# EAGLE schematic RU-PCBA-2X2-001-03 (EAGLE 9.7.0), part 2 of 5
## Sheet 4 of 17: Row 4
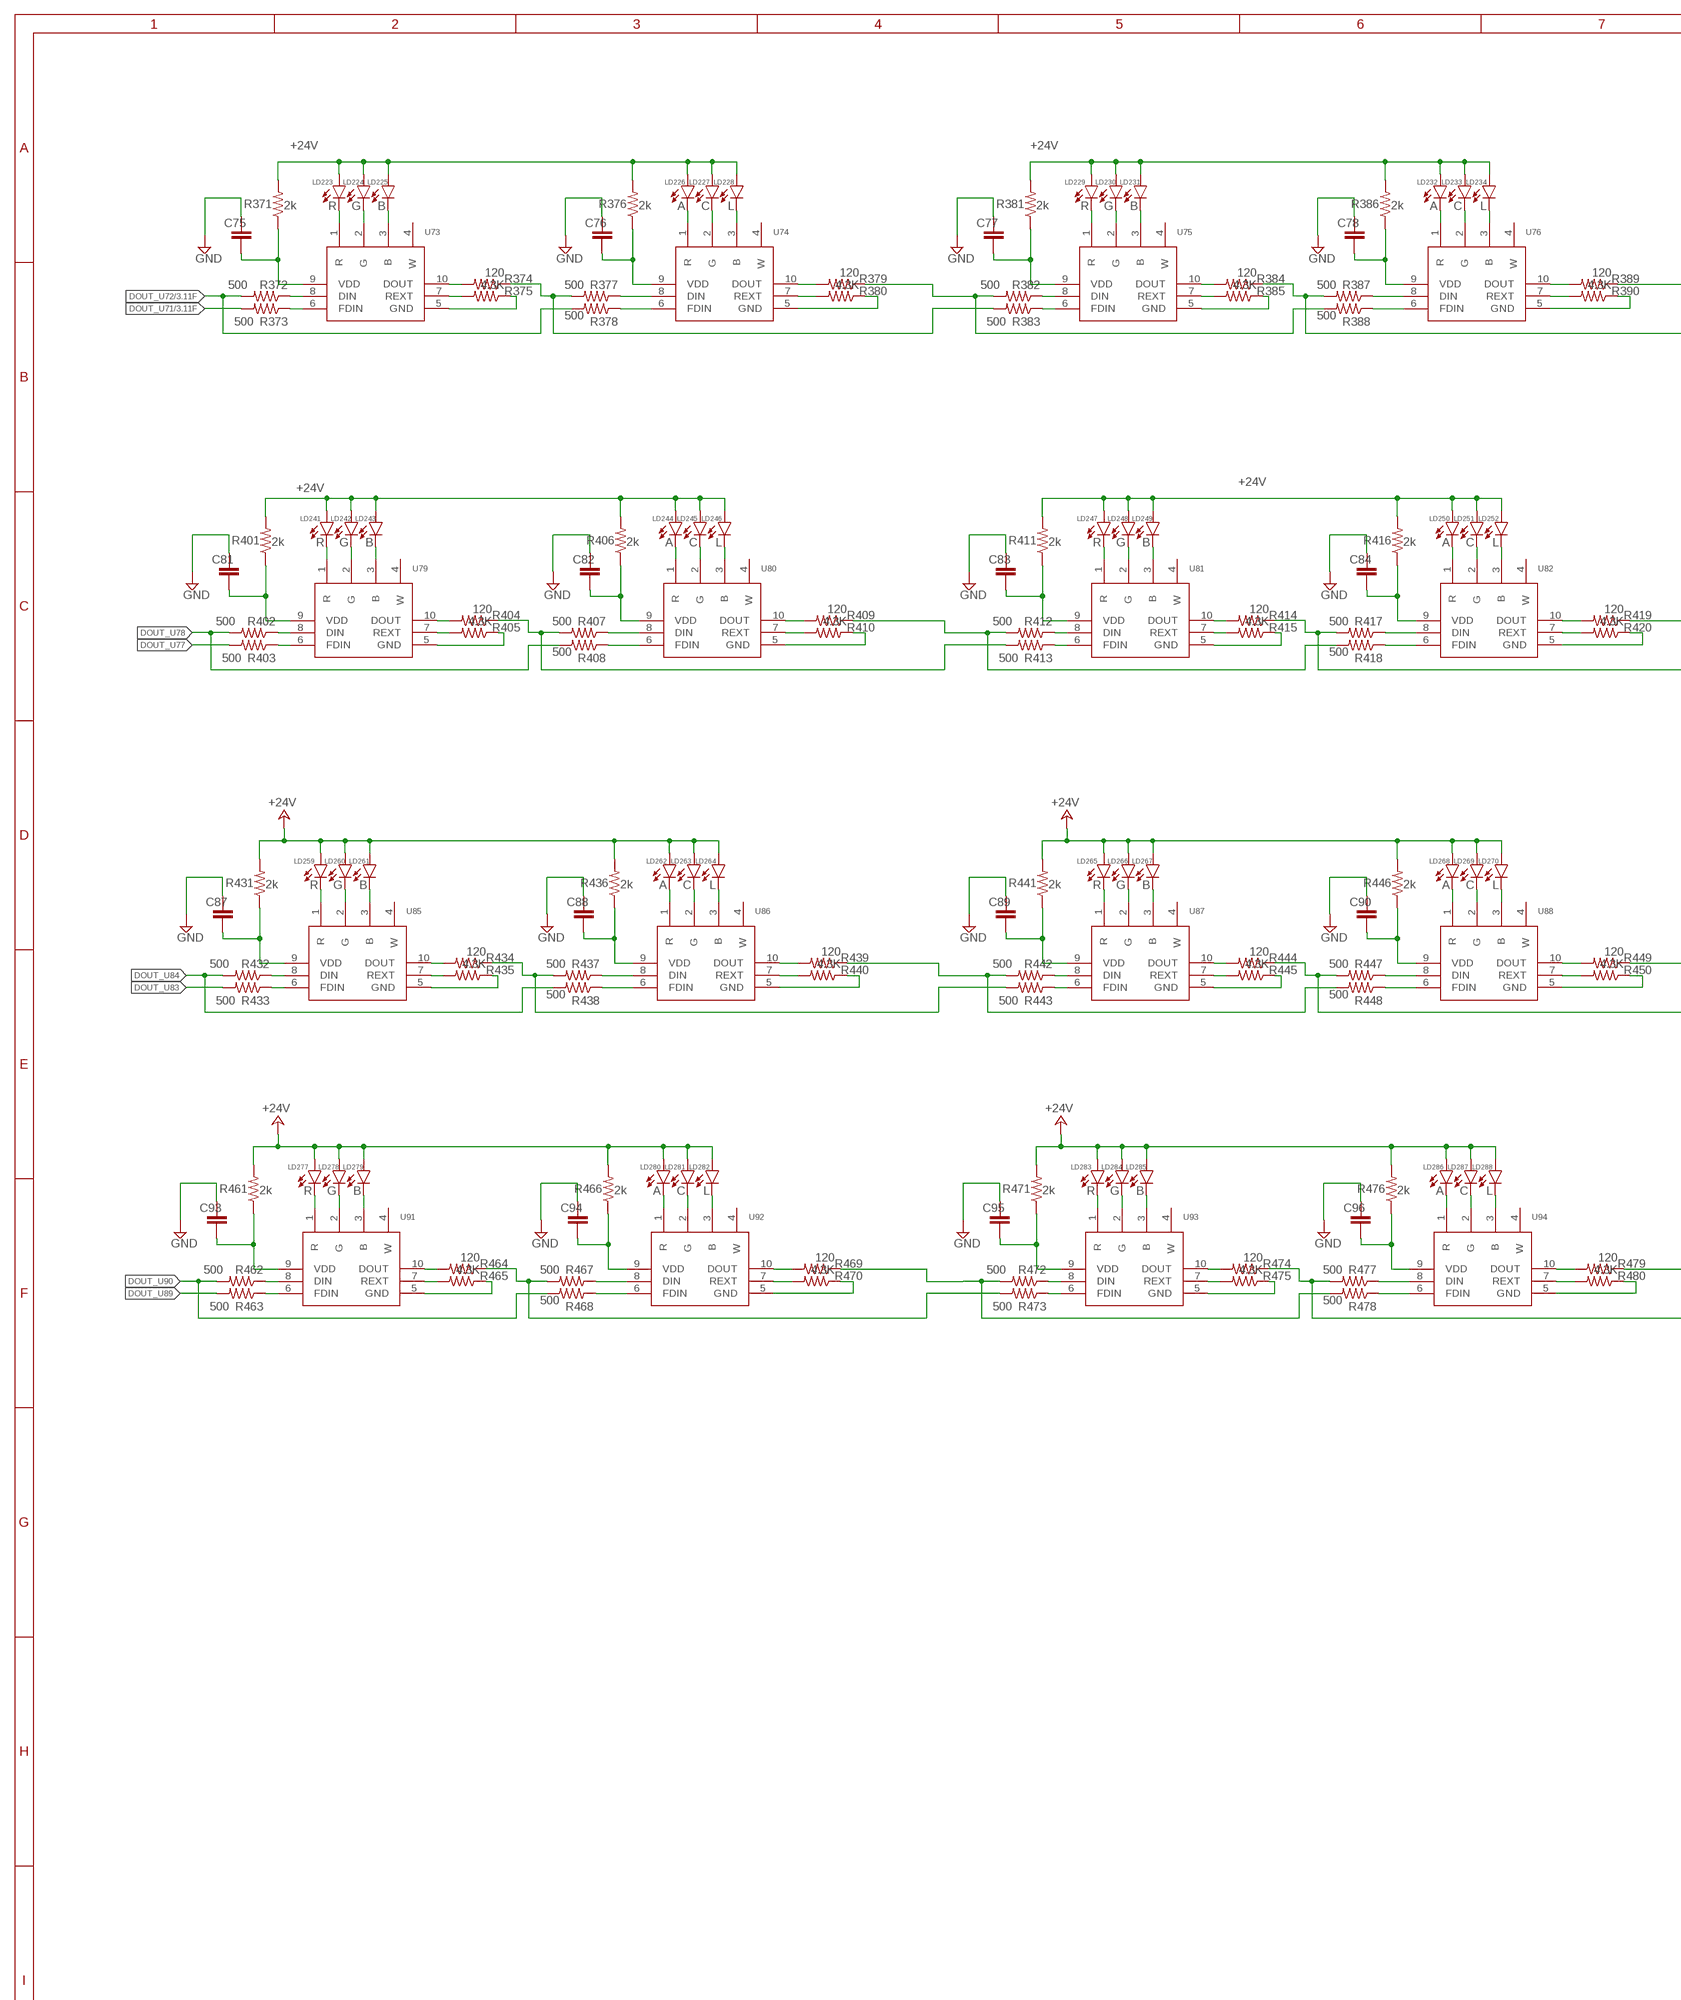
[diagram p6: schematic, sheet 4, part 1 of 2]
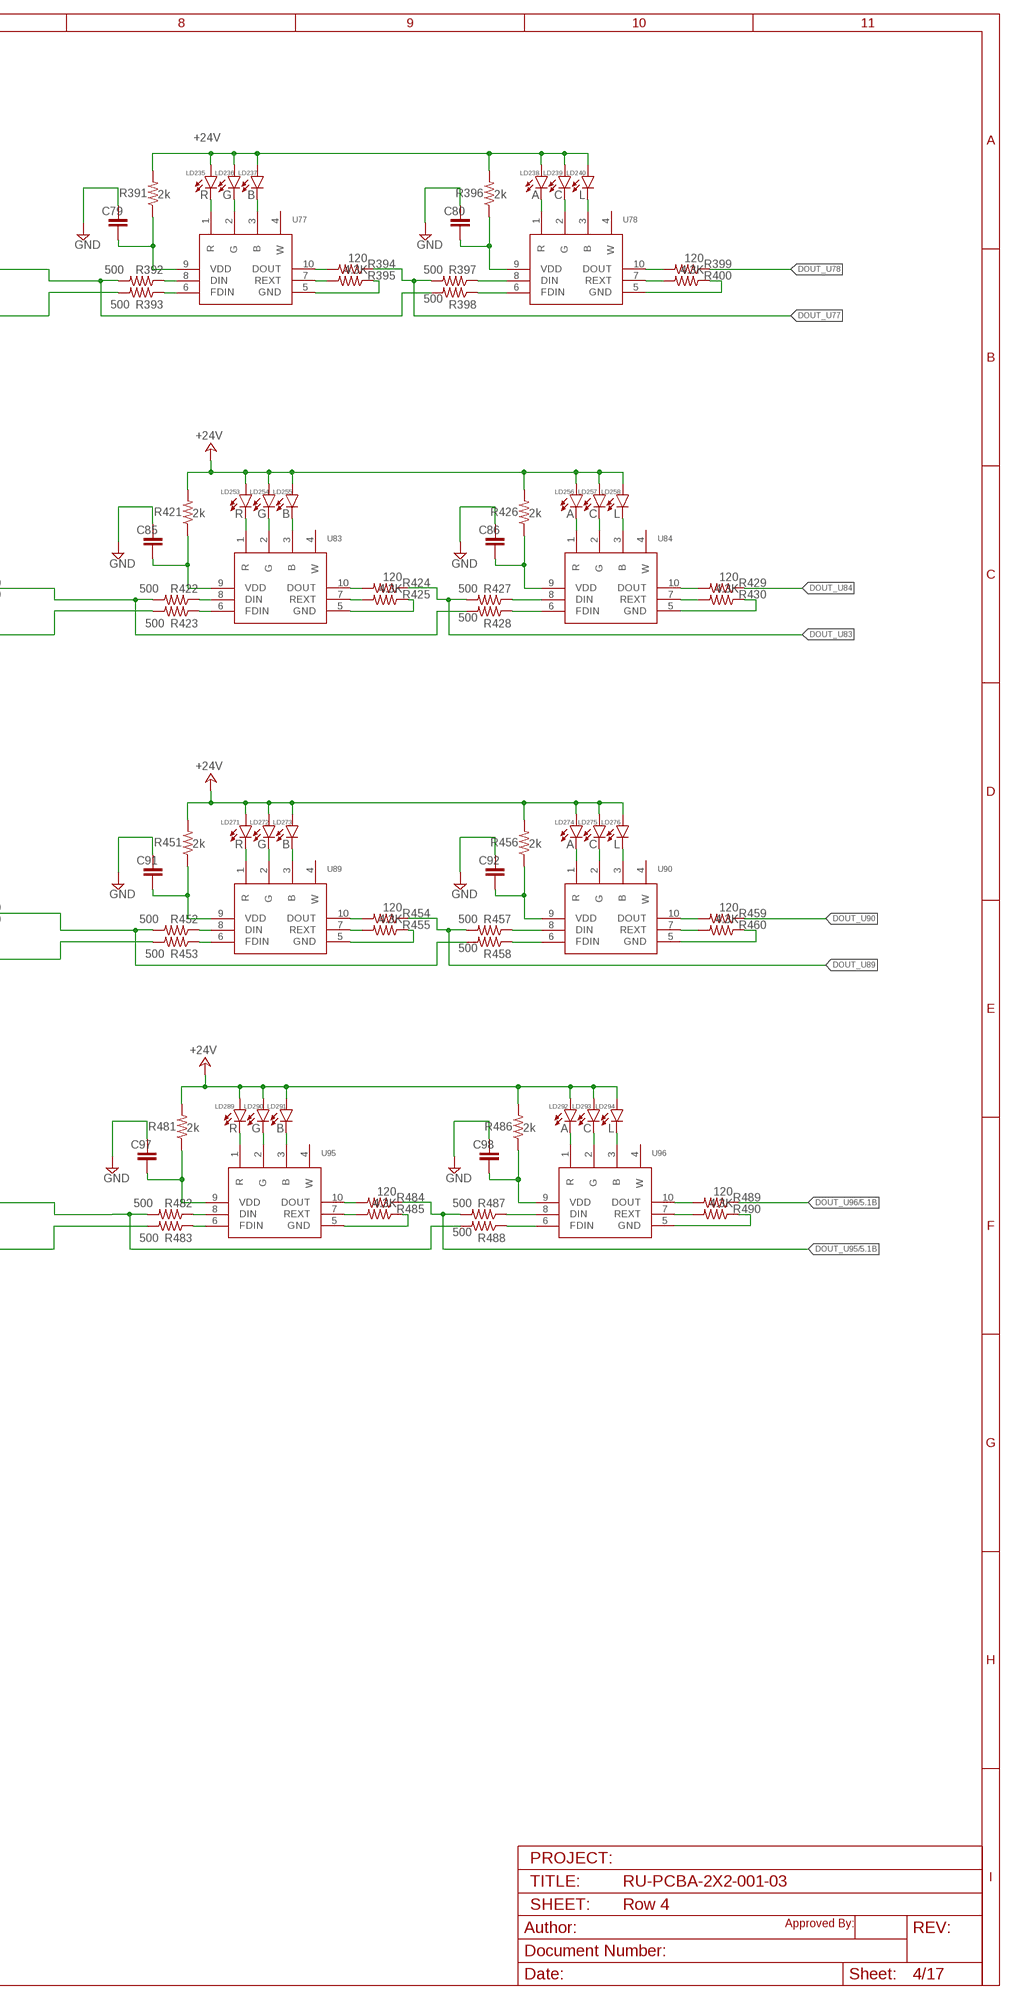
[diagram p7: schematic, sheet 4, part 2 of 2]

### Parts
C75  C-EUC1206  [C1206]
C76  C-EUC1206  [C1206]
C77  C-EUC1206  [C1206]
C78  C-EUC1206  [C1206]
C79  C-EUC1206  [C1206]
C80  C-EUC1206  [C1206]
C81  C-EUC1206  [C1206]
C82  C-EUC1206  [C1206]
C83  C-EUC1206  [C1206]
C84  C-EUC1206  [C1206]
C85  C-EUC1206  [C1206]
C86  C-EUC1206  [C1206]
C87  C-EUC1206  [C1206]
C88  C-EUC1206  [C1206]
C89  C-EUC1206  [C1206]
C90  C-EUC1206  [C1206]
C91  C-EUC1206  [C1206]
C92  C-EUC1206  [C1206]
C93  C-EUC1206  [C1206]
C94  C-EUC1206  [C1206]
C95  C-EUC1206  [C1206]
C96  C-EUC1206  [C1206]
C97  C-EUC1206  [C1206]
C98  C-EUC1206  [C1206]
LD223  R  5050LED  [5050LED]
LD224  G  5050LED  [5050LED]
LD225  B  5050LED  [5050LED]
LD226  A  5050LED  [5050LED]
LD227  C  5050LED  [5050LED]
LD228  L  5050LED  [5050LED]
LD229  R  5050LED  [5050LED]
LD230  G  5050LED  [5050LED]
LD231  B  5050LED  [5050LED]
LD232  A  5050LED  [5050LED]
LD233  C  5050LED  [5050LED]
LD234  L  5050LED  [5050LED]
LD235  R  5050LED  [5050LED]
LD236  G  5050LED  [5050LED]
LD237  B  5050LED  [5050LED]
LD238  A  5050LED  [5050LED]
LD239  C  5050LED  [5050LED]
LD240  L  5050LED  [5050LED]
LD241  R  5050LED  [5050LED]
LD242  G  5050LED  [5050LED]
LD243  B  5050LED  [5050LED]
LD244  A  5050LED  [5050LED]
LD245  C  5050LED  [5050LED]
LD246  L  5050LED  [5050LED]
LD247  R  5050LED  [5050LED]
LD248  G  5050LED  [5050LED]
LD249  B  5050LED  [5050LED]
LD250  A  5050LED  [5050LED]
LD251  C  5050LED  [5050LED]
LD252  L  5050LED  [5050LED]
LD253  R  5050LED  [5050LED]
LD254  G  5050LED  [5050LED]
LD255  B  5050LED  [5050LED]
LD256  A  5050LED  [5050LED]
LD257  C  5050LED  [5050LED]
LD258  L  5050LED  [5050LED]
LD259  R  5050LED  [5050LED]
LD260  G  5050LED  [5050LED]
LD261  B  5050LED  [5050LED]
LD262  A  5050LED  [5050LED]
LD263  C  5050LED  [5050LED]
LD264  L  5050LED  [5050LED]
LD265  R  5050LED  [5050LED]
LD266  G  5050LED  [5050LED]
LD267  B  5050LED  [5050LED]
LD268  A  5050LED  [5050LED]
LD269  C  5050LED  [5050LED]
LD270  L  5050LED  [5050LED]
LD271  R  5050LED  [5050LED]
LD272  G  5050LED  [5050LED]
LD273  B  5050LED  [5050LED]
LD274  A  5050LED  [5050LED]
LD275  C  5050LED  [5050LED]
LD276  L  5050LED  [5050LED]
LD277  R  5050LED  [5050LED]
LD278  G  5050LED  [5050LED]
LD279  B  5050LED  [5050LED]
LD280  A  5050LED  [5050LED]
LD281  C  5050LED  [5050LED]
LD282  L  5050LED  [5050LED]
LD283  R  5050LED  [5050LED]
LD284  G  5050LED  [5050LED]
LD285  B  5050LED  [5050LED]
LD286  A  5050LED  [5050LED]
LD287  C  5050LED  [5050LED]
LD288  L  5050LED  [5050LED]
LD289  R  5050LED  [5050LED]
LD290  G  5050LED  [5050LED]
LD291  B  5050LED  [5050LED]
LD292  A  5050LED  [5050LED]
LD293  C  5050LED  [5050LED]
LD294  L  5050LED  [5050LED]
R371  2k  R-US_R1206  [R1206]
R372  500  R-US_R0805  [R0805]
R373  500  R-US_R0805  [R0805]
R374  120  R-US_R0805  [R0805]
R375  4.3K  R-US_R0805  [R0805]
R376  2k  R-US_R1206  [R1206]
R377  500  R-US_R0805  [R0805]
R378  500  R-US_R0805  [R0805]
R379  120  R-US_R0805  [R0805]
R380  4.3K  R-US_R0805  [R0805]
R381  2k  R-US_R1206  [R1206]
R382  500  R-US_R0805  [R0805]
R383  500  R-US_R0805  [R0805]
R384  120  R-US_R0805  [R0805]
R385  4.3K  R-US_R0805  [R0805]
R386  2k  R-US_R1206  [R1206]
R387  500  R-US_R0805  [R0805]
R388  500  R-US_R0805  [R0805]
R389  120  R-US_R0805  [R0805]
R390  4.3K  R-US_R0805  [R0805]
R391  2k  R-US_R1206  [R1206]
R392  500  R-US_R0805  [R0805]
R393  500  R-US_R0805  [R0805]
R394  120  R-US_R0805  [R0805]
R395  4.3K  R-US_R0805  [R0805]
R396  2k  R-US_R1206  [R1206]
R397  500  R-US_R0805  [R0805]
R398  500  R-US_R0805  [R0805]
R399  120  R-US_R0805  [R0805]
R400  4.3K  R-US_R0805  [R0805]
R401  2k  R-US_R1206  [R1206]
R402  500  R-US_R0805  [R0805]
R403  500  R-US_R0805  [R0805]
R404  120  R-US_R0805  [R0805]
R405  4.3K  R-US_R0805  [R0805]
R406  2k  R-US_R1206  [R1206]
R407  500  R-US_R0805  [R0805]
R408  500  R-US_R0805  [R0805]
R409  120  R-US_R0805  [R0805]
R410  4.3K  R-US_R0805  [R0805]
R411  2k  R-US_R1206  [R1206]
R412  500  R-US_R0805  [R0805]
R413  500  R-US_R0805  [R0805]
R414  120  R-US_R0805  [R0805]
R415  4.3K  R-US_R0805  [R0805]
R416  2k  R-US_R1206  [R1206]
R417  500  R-US_R0805  [R0805]
R418  500  R-US_R0805  [R0805]
R419  120  R-US_R0805  [R0805]
R420  4.3K  R-US_R0805  [R0805]
R421  2k  R-US_R1206  [R1206]
R422  500  R-US_R0805  [R0805]
R423  500  R-US_R0805  [R0805]
R424  120  R-US_R0805  [R0805]
R425  4.3K  R-US_R0805  [R0805]
R426  2k  R-US_R1206  [R1206]
R427  500  R-US_R0805  [R0805]
R428  500  R-US_R0805  [R0805]
R429  120  R-US_R0805  [R0805]
R430  4.3K  R-US_R0805  [R0805]
R431  2k  R-US_R1206  [R1206]
R432  500  R-US_R0805  [R0805]
R433  500  R-US_R0805  [R0805]
R434  120  R-US_R0805  [R0805]
R435  4.3K  R-US_R0805  [R0805]
R436  2k  R-US_R1206  [R1206]
R437  500  R-US_R0805  [R0805]
R438  500  R-US_R0805  [R0805]
R439  120  R-US_R0805  [R0805]
R440  4.3K  R-US_R0805  [R0805]
R441  2k  R-US_R1206  [R1206]
R442  500  R-US_R0805  [R0805]
R443  500  R-US_R0805  [R0805]
R444  120  R-US_R0805  [R0805]
R445  4.3K  R-US_R0805  [R0805]
R446  2k  R-US_R1206  [R1206]
R447  500  R-US_R0805  [R0805]
R448  500  R-US_R0805  [R0805]
R449  120  R-US_R0805  [R0805]
R450  4.3K  R-US_R0805  [R0805]
R451  2k  R-US_R1206  [R1206]
R452  500  R-US_R0805  [R0805]
R453  500  R-US_R0805  [R0805]
R454  120  R-US_R0805  [R0805]
R455  4.3K  R-US_R0805  [R0805]
R456  2k  R-US_R1206  [R1206]
R457  500  R-US_R0805  [R0805]
R458  500  R-US_R0805  [R0805]
R459  120  R-US_R0805  [R0805]
R460  4.3K  R-US_R0805  [R0805]
R461  2k  R-US_R1206  [R1206]
R462  500  R-US_R0805  [R0805]
R463  500  R-US_R0805  [R0805]
R464  120  R-US_R0805  [R0805]
R465  4.3K  R-US_R0805  [R0805]
R466  2k  R-US_R1206  [R1206]
R467  500  R-US_R0805  [R0805]
R468  500  R-US_R0805  [R0805]
R469  120  R-US_R0805  [R0805]
R470  4.3K  R-US_R0805  [R0805]
R471  2k  R-US_R1206  [R1206]
R472  500  R-US_R0805  [R0805]
R473  500  R-US_R0805  [R0805]
R474  120  R-US_R0805  [R0805]
R475  4.3K  R-US_R0805  [R0805]
R476  2k  R-US_R1206  [R1206]
R477  500  R-US_R0805  [R0805]
R478  500  R-US_R0805  [R0805]
R479  120  R-US_R0805  [R0805]
R480  4.3K  R-US_R0805  [R0805]
R481  2k  R-US_R1206  [R1206]
R482  500  R-US_R0805  [R0805]
R483  500  R-US_R0805  [R0805]
R484  120  R-US_R0805  [R0805]
R485  4.3K  R-US_R0805  [R0805]
R486  2k  R-US_R1206  [R1206]
R487  500  R-US_R0805  [R0805]
R488  500  R-US_R0805  [R0805]
R489  120  R-US_R0805  [R0805]
R490  4.3K  R-US_R0805  [R0805]
U73  UCS7604  [SOP100P600X175-10N]
U74  UCS7604  [SOP100P600X175-10N]
U75  UCS7604  [SOP100P600X175-10N]
U76  UCS7604  [SOP100P600X175-10N]
U77  UCS7604  [SOP100P600X175-10N]
U78  UCS7604  [SOP100P600X175-10N]
U79  UCS7604  [SOP100P600X175-10N]
U80  UCS7604  [SOP100P600X175-10N]
U81  UCS7604  [SOP100P600X175-10N]
U82  UCS7604  [SOP100P600X175-10N]
U83  UCS7604  [SOP100P600X175-10N]
U84  UCS7604  [SOP100P600X175-10N]
U85  UCS7604  [SOP100P600X175-10N]
U86  UCS7604  [SOP100P600X175-10N]
U87  UCS7604  [SOP100P600X175-10N]
U88  UCS7604  [SOP100P600X175-10N]
U89  UCS7604  [SOP100P600X175-10N]
U90  UCS7604  [SOP100P600X175-10N]
U91  UCS7604  [SOP100P600X175-10N]
U92  UCS7604  [SOP100P600X175-10N]
U93  UCS7604  [SOP100P600X175-10N]
U94  UCS7604  [SOP100P600X175-10N]
U95  UCS7604  [SOP100P600X175-10N]
U96  UCS7604  [SOP100P600X175-10N]

### Nets
+24V: LD223.A LD224.A LD225.A LD226.A LD227.A LD228.A LD229.A LD230.A LD231.A LD232.A LD233.A LD234.A LD235.A LD236.A LD237.A LD238.A LD239.A LD240.A LD241.A LD242.A LD243.A LD244.A LD245.A LD246.A LD247.A LD248.A LD249.A LD250.A LD251.A LD252.A LD253.A LD254.A LD255.A LD256.A LD257.A LD258.A LD259.A LD260.A LD261.A LD262.A LD263.A LD264.A LD265.A LD266.A LD267.A LD268.A LD269.A LD270.A LD271.A LD272.A LD273.A LD274.A LD275.A LD276.A LD277.A LD278.A LD279.A LD280.A LD281.A LD282.A LD283.A LD284.A LD285.A LD286.A LD287.A LD288.A LD289.A LD290.A LD291.A LD292.A LD293.A LD294.A R371.2 R376.2 R381.2 R386.2 R391.2 R396.2 R401.2 R406.2 R411.2 R416.2 R421.2 R426.2 R431.2 R436.2 R441.2 R446.2 R451.2 R456.2 R461.2 R466.2 R471.2 R476.2 R481.2 R486.2 ; also sheet 1,2,3,5,6,7,8,9,10,11,12,13,14
DOUT_U71: R373.2 ; also sheet 3
DOUT_U72: R372.2 R378.2 ; also sheet 3
DOUT_U77: R394.1 R397.2 R403.2
DOUT_U78: R399.1 R402.2 R408.2
DOUT_U83: R424.1 R427.2 R433.2
DOUT_U84: R429.1 R432.2 R438.2
DOUT_U89: R454.1 R457.2 R463.2
DOUT_U90: R459.1 R462.2 R468.2
DOUT_U95: R484.1 R487.2 ; also sheet 5
DOUT_U96: R489.1 ; also sheet 5
GND: C75.2 C76.2 C77.2 C78.2 C79.2 C80.2 C81.2 C82.2 C83.2 C84.2 C85.2 C86.2 C87.2 C88.2 C89.2 C90.2 C91.2 C92.2 C93.2 C94.2 C95.2 C96.2 C97.2 C98.2 R375.1 R380.1 R385.1 R390.1 R395.1 R400.1 R405.1 R410.1 R415.1 R420.1 R425.1 R430.1 R435.1 R440.1 R445.1 R450.1 R455.1 R460.1 R465.1 R470.1 R475.1 R480.1 R485.1 R490.1 U73.5(GND) U74.5(GND) U75.5(GND) U76.5(GND) U77.5(GND) U78.5(GND) U79.5(GND) U80.5(GND) U81.5(GND) U82.5(GND) U83.5(GND) U84.5(GND) U85.5(GND) U86.5(GND) U87.5(GND) U88.5(GND) U89.5(GND) U90.5(GND) U91.5(GND) U92.5(GND) U93.5(GND) U94.5(GND) U95.5(GND) U96.5(GND) ; also sheet 1,2,3,5,6,7,8,9,10,11,12,13,14
N$1: C83.1 R411.1 U81.9(VDD)
N$778: LD247.K(C) U81.1(R)
N$779: C75.1 R371.1 U73.9(VDD)
N$780: LD223.K(C) U73.1(R)
N$781: LD224.K(C) U73.2(G)
N$782: LD225.K(C) U73.3(B)
N$783: R372.1 U73.8(DIN)
N$784: R373.1 U73.6(FDIN)
N$785: R374.2 U73.10(DOUT)
N$786: R375.2 U73.7(REXT)
N$787: LD226.K(C) U74.1(R)
N$788: LD227.K(C) U74.2(G)
N$789: LD228.K(C) U74.3(B)
N$790: C76.1 R376.1 U74.9(VDD)
N$791: R377.1 U74.8(DIN)
N$793: R378.1 U74.6(FDIN)
N$796: R379.2 U74.10(DOUT)
N$797: R380.2 U74.7(REXT)
N$798: R379.1 R382.2 R388.2
N$799: LD248.K(C) U81.2(G)
N$800: C77.1 R381.1 U75.9(VDD)
N$801: LD229.K(C) U75.1(R)
N$802: LD230.K(C) U75.2(G)
N$803: LD231.K(C) U75.3(B)
N$804: R382.1 U75.8(DIN)
N$805: R383.1 U75.6(FDIN)
N$806: R384.2 U75.10(DOUT)
N$807: R385.2 U75.7(REXT)
N$808: LD232.K(C) U76.1(R)
N$809: LD233.K(C) U76.2(G)
N$810: LD234.K(C) U76.3(B)
N$811: C78.1 R386.1 U76.9(VDD)
N$812: R387.1 U76.8(DIN)
N$814: R388.1 U76.6(FDIN)
N$816: R374.1 R377.2 R383.2
N$817: R389.2 U76.10(DOUT)
N$818: R390.2 U76.7(REXT)
N$819: R389.1 R392.2 R398.2
N$820: LD249.K(C) U81.3(B)
N$821: C79.1 R391.1 U77.9(VDD)
N$822: LD235.K(C) U77.1(R)
N$823: LD236.K(C) U77.2(G)
N$824: LD237.K(C) U77.3(B)
N$825: R392.1 U77.8(DIN)
N$826: R393.1 U77.6(FDIN)
N$827: R394.2 U77.10(DOUT)
N$828: R395.2 U77.7(REXT)
N$829: LD238.K(C) U78.1(R)
N$830: LD239.K(C) U78.2(G)
N$831: LD240.K(C) U78.3(B)
N$832: C80.1 R396.1 U78.9(VDD)
N$833: R397.1 U78.8(DIN)
N$835: R398.1 U78.6(FDIN)
N$837: R384.1 R387.2 R393.2
N$838: R399.2 U78.10(DOUT)
N$839: R400.2 U78.7(REXT)
N$841: R412.1 U81.8(DIN)
N$842: C81.1 R401.1 U79.9(VDD)
N$843: LD241.K(C) U79.1(R)
N$844: LD242.K(C) U79.2(G)
N$845: LD243.K(C) U79.3(B)
N$846: R402.1 U79.8(DIN)
N$847: R403.1 U79.6(FDIN)
N$848: R404.2 U79.10(DOUT)
N$849: R405.2 U79.7(REXT)
N$850: LD244.K(C) U80.1(R)
N$851: LD245.K(C) U80.2(G)
N$852: LD246.K(C) U80.3(B)
N$853: C82.1 R406.1 U80.9(VDD)
N$854: R407.1 U80.8(DIN)
N$856: R408.1 U80.6(FDIN)
N$859: R409.2 U80.10(DOUT)
N$860: R410.2 U80.7(REXT)
N$861: R409.1 R412.2 R418.2
N$862: R413.1 U81.6(FDIN)
N$863: R414.2 U81.10(DOUT)
N$864: R415.2 U81.7(REXT)
N$865: LD250.K(C) U82.1(R)
N$866: LD251.K(C) U82.2(G)
N$867: LD252.K(C) U82.3(B)
N$868: C84.1 R416.1 U82.9(VDD)
N$869: R417.1 U82.8(DIN)
N$871: R418.1 U82.6(FDIN)
N$873: R404.1 R407.2 R413.2
N$874: R419.2 U82.10(DOUT)
N$875: R420.2 U82.7(REXT)
N$876: R419.1 R422.2 R428.2
N$877: C85.1 R421.1 U83.9(VDD)
N$878: LD253.K(C) U83.1(R)
N$879: LD254.K(C) U83.2(G)
N$880: LD255.K(C) U83.3(B)
N$881: R422.1 U83.8(DIN)
N$882: R423.1 U83.6(FDIN)
N$883: R424.2 U83.10(DOUT)
N$884: R425.2 U83.7(REXT)
N$885: LD256.K(C) U84.1(R)
N$886: LD257.K(C) U84.2(G)
N$887: LD258.K(C) U84.3(B)
N$888: C86.1 R426.1 U84.9(VDD)
N$889: R427.1 U84.8(DIN)
N$891: R428.1 U84.6(FDIN)
N$893: R414.1 R417.2 R423.2
N$894: R429.2 U84.10(DOUT)
N$895: R430.2 U84.7(REXT)
N$897: C87.1 R431.1 U85.9(VDD)
N$898: LD259.K(C) U85.1(R)
N$899: LD260.K(C) U85.2(G)
N$900: LD261.K(C) U85.3(B)
N$901: R432.1 U85.8(DIN)
N$902: R433.1 U85.6(FDIN)
N$903: R434.2 U85.10(DOUT)
N$904: R435.2 U85.7(REXT)
N$905: LD262.K(C) U86.1(R)
N$906: LD263.K(C) U86.2(G)
N$907: LD264.K(C) U86.3(B)
N$908: C88.1 R436.1 U86.9(VDD)
N$909: R437.1 U86.8(DIN)
N$911: R438.1 U86.6(FDIN)
N$914: R439.2 U86.10(DOUT)
N$915: R440.2 U86.7(REXT)
N$916: R439.1 R442.2 R448.2
N$917: C89.1 R441.1 U87.9(VDD)
N$918: LD265.K(C) U87.1(R)
N$919: LD266.K(C) U87.2(G)
N$920: LD267.K(C) U87.3(B)
N$921: R442.1 U87.8(DIN)
N$922: R443.1 U87.6(FDIN)
N$923: R444.2 U87.10(DOUT)
N$924: R445.2 U87.7(REXT)
N$925: LD268.K(C) U88.1(R)
N$926: LD269.K(C) U88.2(G)
N$927: LD270.K(C) U88.3(B)
N$928: C90.1 R446.1 U88.9(VDD)
N$929: R447.1 U88.8(DIN)
N$931: R448.1 U88.6(FDIN)
N$933: R434.1 R437.2 R443.2
N$934: R449.2 U88.10(DOUT)
N$935: R450.2 U88.7(REXT)
N$936: R449.1 R452.2 R458.2
N$937: C91.1 R451.1 U89.9(VDD)
N$938: LD271.K(C) U89.1(R)
N$939: LD272.K(C) U89.2(G)
N$940: LD273.K(C) U89.3(B)
N$941: R452.1 U89.8(DIN)
N$942: R453.1 U89.6(FDIN)
N$943: R454.2 U89.10(DOUT)
N$944: R455.2 U89.7(REXT)
N$945: LD274.K(C) U90.1(R)
N$946: LD275.K(C) U90.2(G)
N$947: LD276.K(C) U90.3(B)
N$948: C92.1 R456.1 U90.9(VDD)
N$949: R457.1 U90.8(DIN)
N$951: R458.1 U90.6(FDIN)
N$953: R444.1 R447.2 R453.2
N$954: R459.2 U90.10(DOUT)
N$955: R460.2 U90.7(REXT)
N$957: C93.1 R461.1 U91.9(VDD)
N$958: LD277.K(C) U91.1(R)
N$959: LD278.K(C) U91.2(G)
N$960: LD279.K(C) U91.3(B)
N$961: R462.1 U91.8(DIN)
N$962: R463.1 U91.6(FDIN)
N$963: R464.2 U91.10(DOUT)
N$964: R465.2 U91.7(REXT)
N$965: LD280.K(C) U92.1(R)
N$966: LD281.K(C) U92.2(G)
N$967: LD282.K(C) U92.3(B)
N$968: C94.1 R466.1 U92.9(VDD)
N$969: R467.1 U92.8(DIN)
N$971: R468.1 U92.6(FDIN)
N$974: R469.2 U92.10(DOUT)
N$975: R470.2 U92.7(REXT)
N$976: R469.1 R472.2 R478.2
N$977: C95.1 R471.1 U93.9(VDD)
N$978: LD283.K(C) U93.1(R)
N$979: LD284.K(C) U93.2(G)
N$980: LD285.K(C) U93.3(B)
N$981: R472.1 U93.8(DIN)
N$982: R473.1 U93.6(FDIN)
N$983: R474.2 U93.10(DOUT)
N$984: R475.2 U93.7(REXT)
N$985: LD286.K(C) U94.1(R)
N$986: LD287.K(C) U94.2(G)
N$987: LD288.K(C) U94.3(B)
N$988: C96.1 R476.1 U94.9(VDD)
N$989: R477.1 U94.8(DIN)
N$990: R474.1 R477.2 R483.2
N$991: R478.1 U94.6(FDIN)
N$993: R464.1 R467.2 R473.2
N$994: R479.2 U94.10(DOUT)
N$995: R480.2 U94.7(REXT)
N$996: R479.1 R482.2 R488.2
N$997: C97.1 R481.1 U95.9(VDD)
N$998: LD289.K(C) U95.1(R)
N$999: LD290.K(C) U95.2(G)
N$1000: LD291.K(C) U95.3(B)
N$1001: R482.1 U95.8(DIN)
N$1002: R483.1 U95.6(FDIN)
N$1003: R484.2 U95.10(DOUT)
N$1004: R485.2 U95.7(REXT)
N$1005: LD292.K(C) U96.1(R)
N$1006: LD293.K(C) U96.2(G)
N$1007: LD294.K(C) U96.3(B)
N$1008: C98.1 R486.1 U96.9(VDD)
N$1009: R487.1 U96.8(DIN)
N$1011: R488.1 U96.6(FDIN)
N$1014: R489.2 U96.10(DOUT)
N$1015: R490.2 U96.7(REXT)
Unconnected: U73.4(W) U74.4(W) U75.4(W) U76.4(W) U77.4(W) U78.4(W) U79.4(W) U80.4(W) U81.4(W) U82.4(W) U83.4(W) U84.4(W) U85.4(W) U86.4(W) U87.4(W) U88.4(W) U89.4(W) U90.4(W) U91.4(W) U92.4(W) U93.4(W) U94.4(W) U95.4(W) U96.4(W)

## Sheet 5 of 17: Row 5
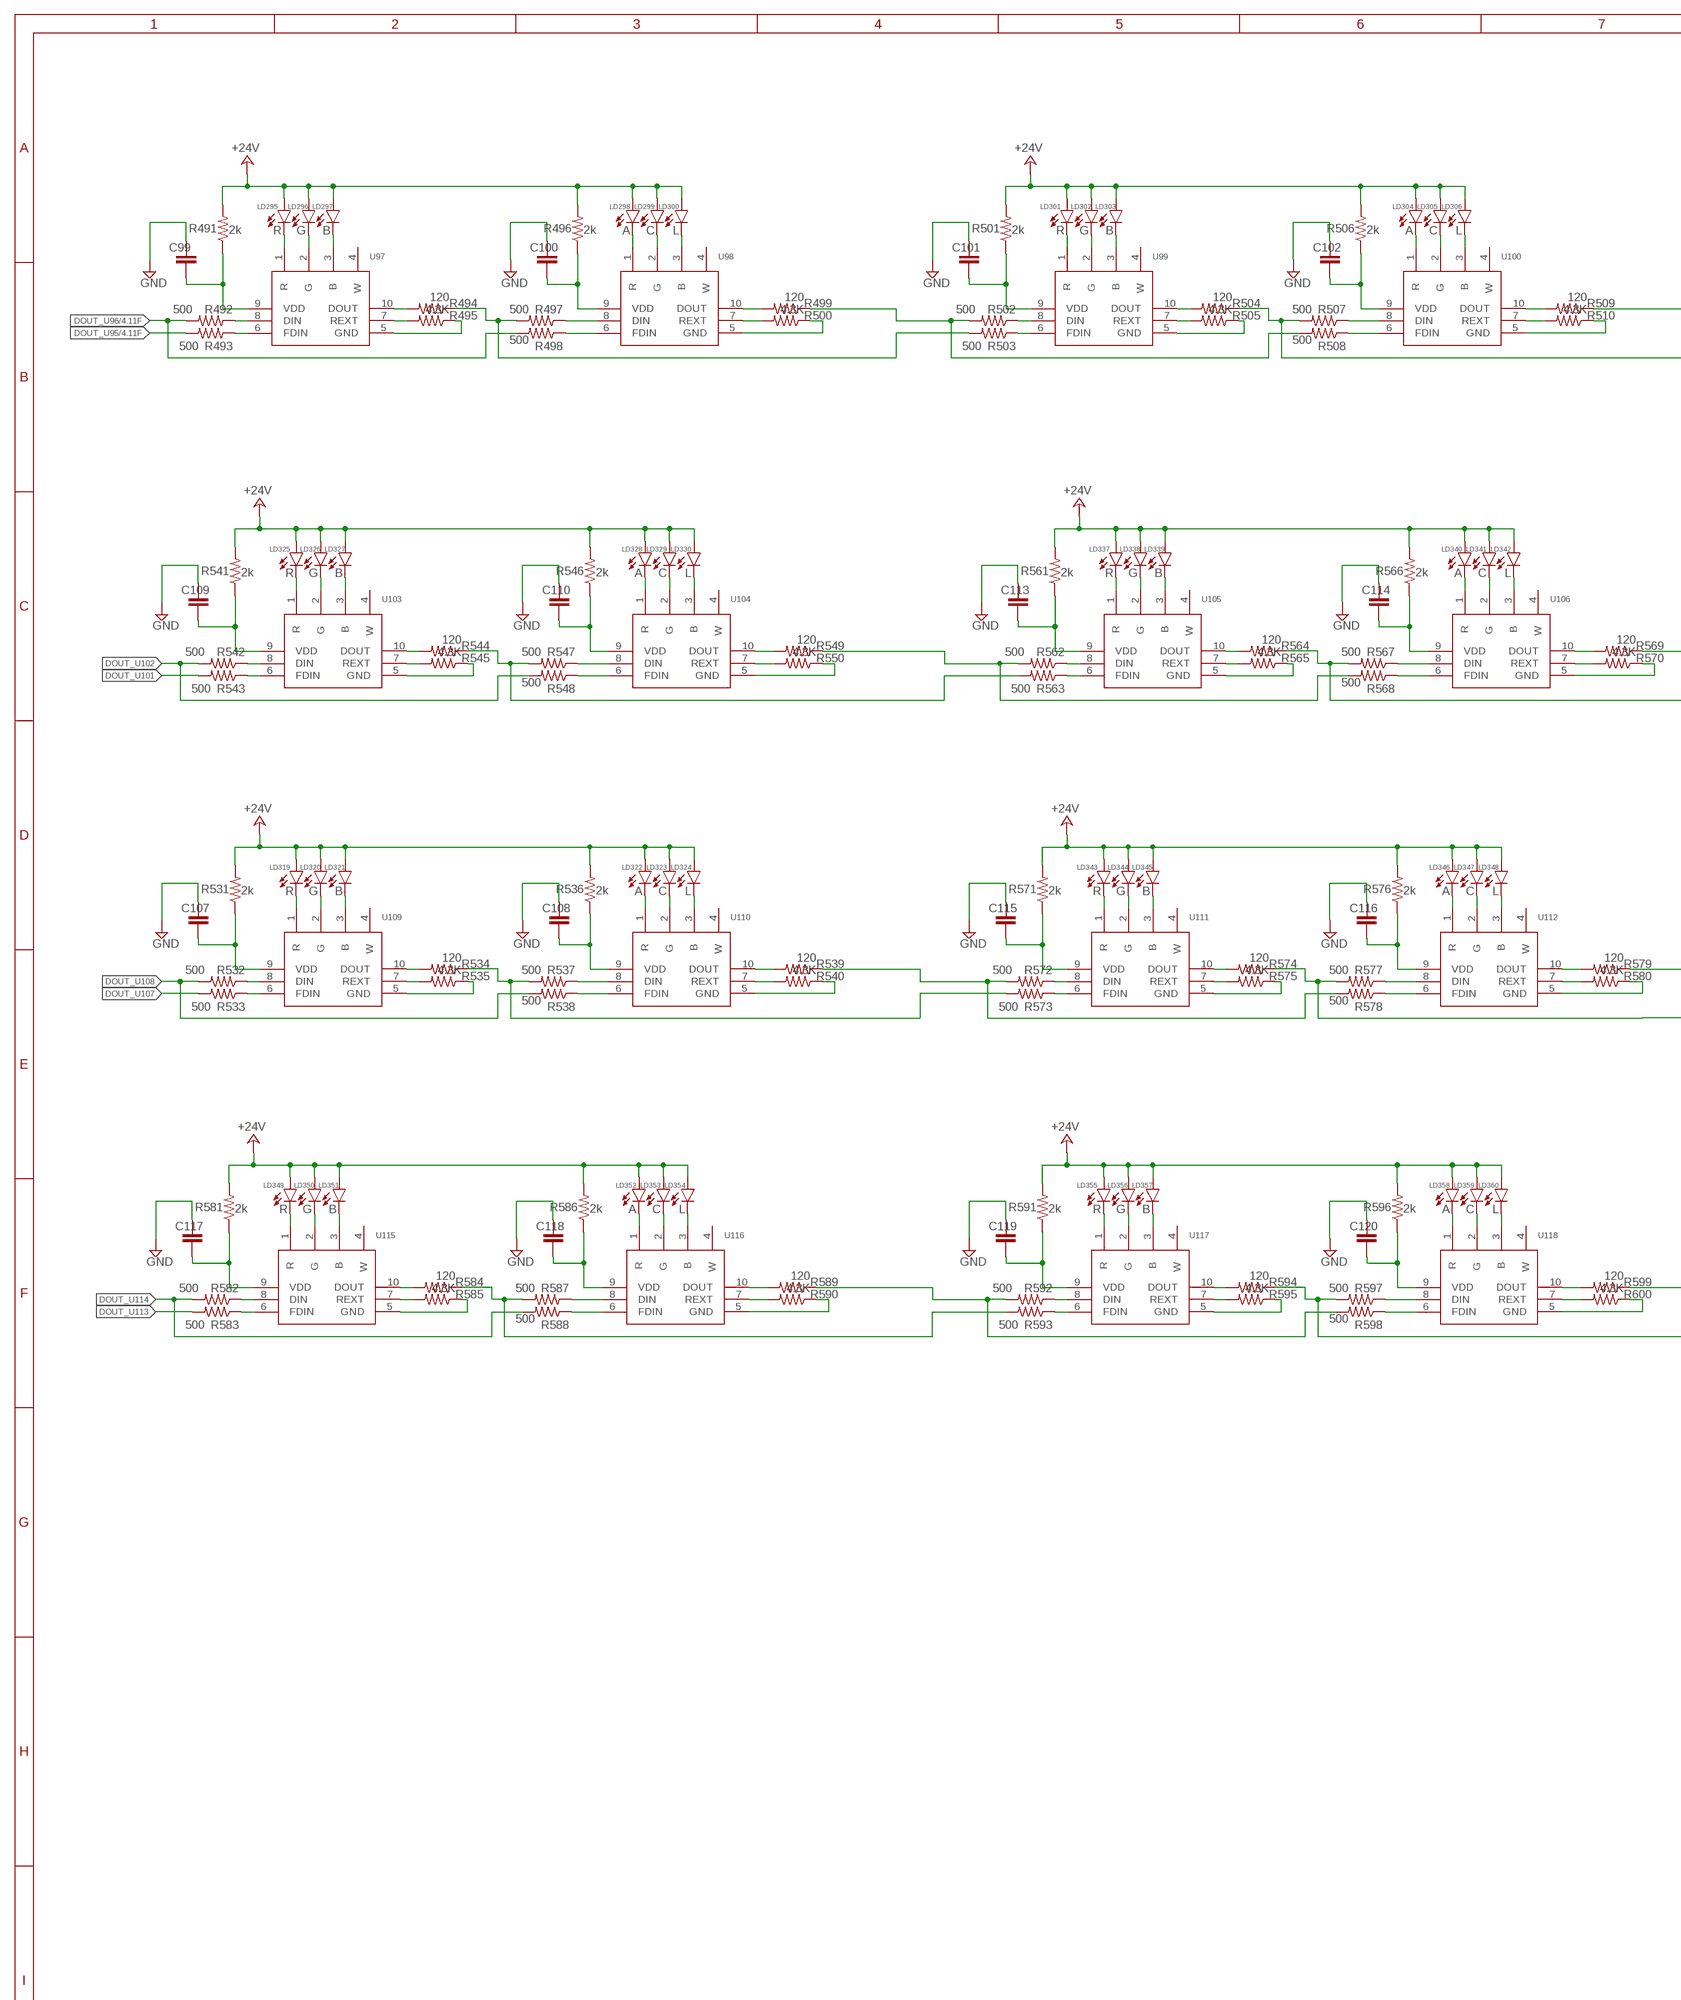
[diagram p8: schematic, sheet 5, part 1 of 2]
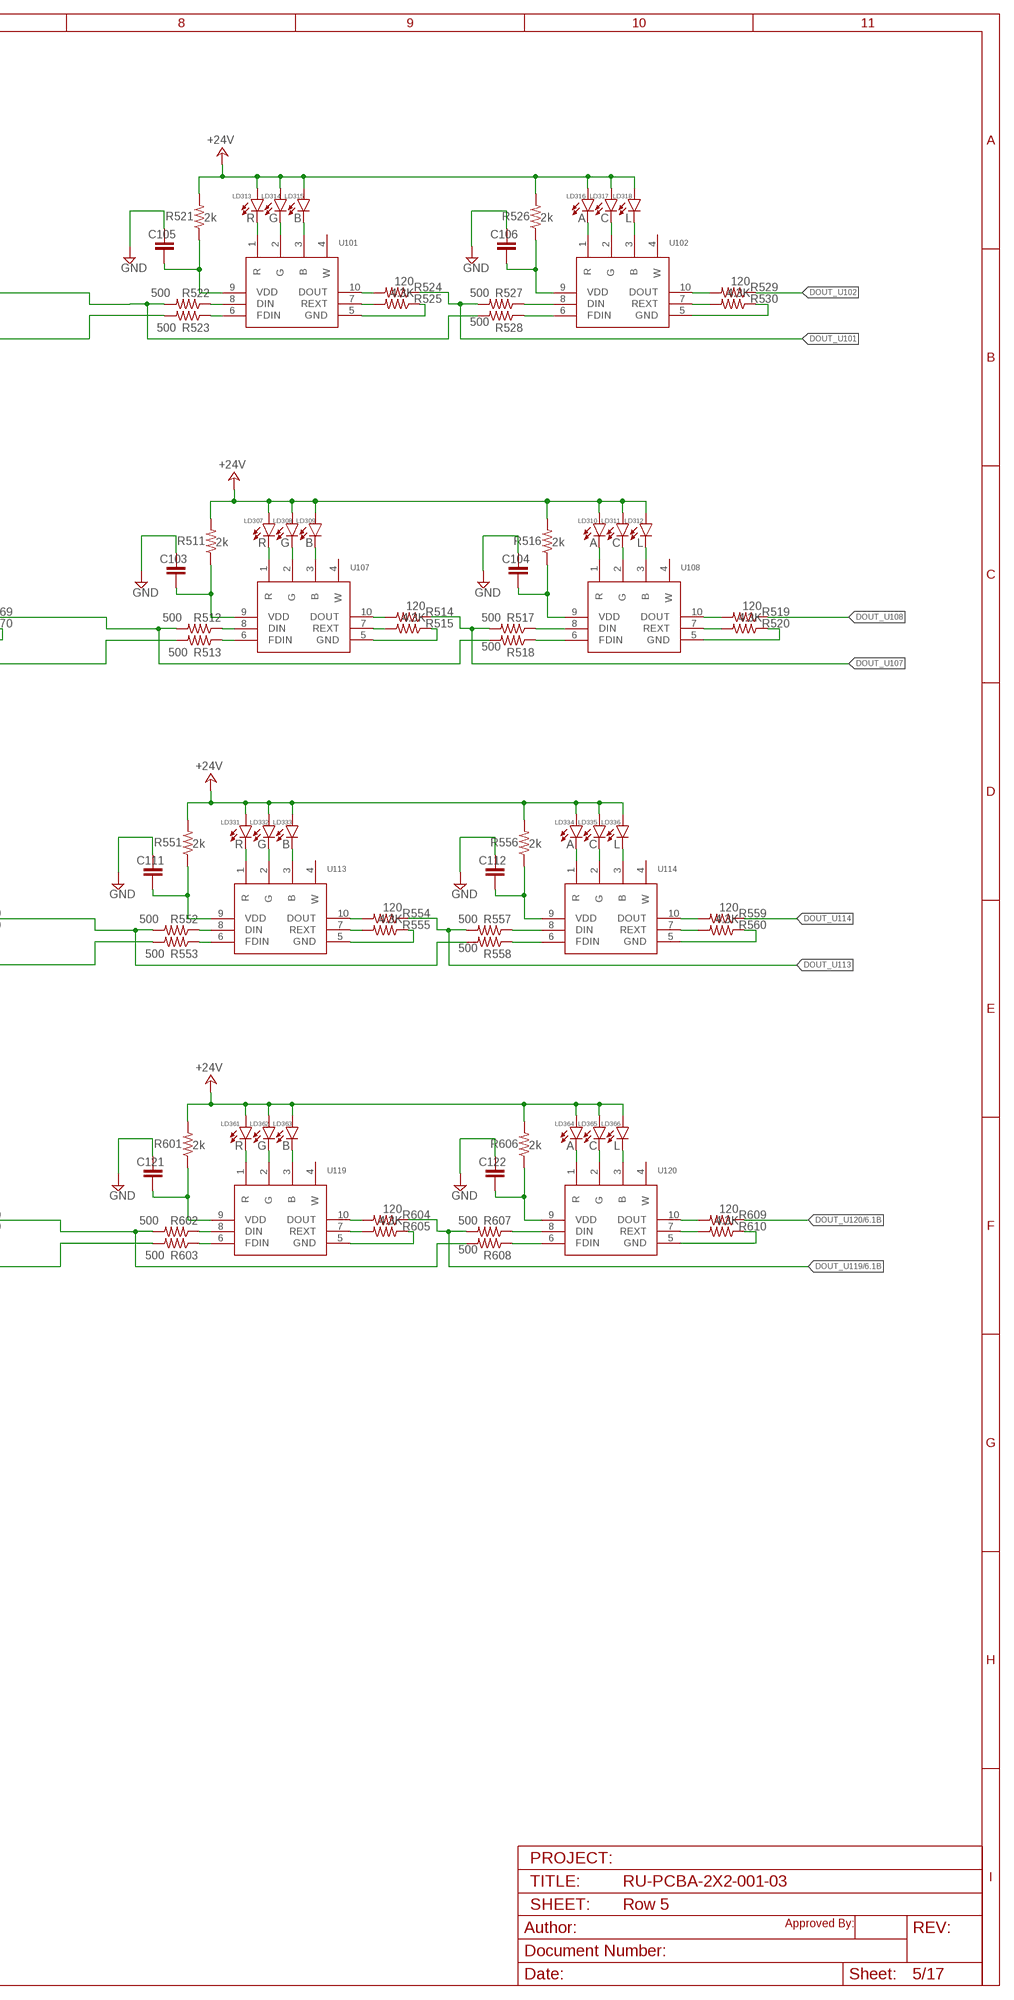
[diagram p9: schematic, sheet 5, part 2 of 2]

### Parts
C99  C-EUC1206  [C1206]
C100  C-EUC1206  [C1206]
C101  C-EUC1206  [C1206]
C102  C-EUC1206  [C1206]
C103  C-EUC1206  [C1206]
C104  C-EUC1206  [C1206]
C105  C-EUC1206  [C1206]
C106  C-EUC1206  [C1206]
C107  C-EUC1206  [C1206]
C108  C-EUC1206  [C1206]
C109  C-EUC1206  [C1206]
C110  C-EUC1206  [C1206]
C111  C-EUC1206  [C1206]
C112  C-EUC1206  [C1206]
C113  C-EUC1206  [C1206]
C114  C-EUC1206  [C1206]
C115  C-EUC1206  [C1206]
C116  C-EUC1206  [C1206]
C117  C-EUC1206  [C1206]
C118  C-EUC1206  [C1206]
C119  C-EUC1206  [C1206]
C120  C-EUC1206  [C1206]
C121  C-EUC1206  [C1206]
C122  C-EUC1206  [C1206]
LD295  R  5050LED  [5050LED]
LD296  G  5050LED  [5050LED]
LD297  B  5050LED  [5050LED]
LD298  A  5050LED  [5050LED]
LD299  C  5050LED  [5050LED]
LD300  L  5050LED  [5050LED]
LD301  R  5050LED  [5050LED]
LD302  G  5050LED  [5050LED]
LD303  B  5050LED  [5050LED]
LD304  A  5050LED  [5050LED]
LD305  C  5050LED  [5050LED]
LD306  L  5050LED  [5050LED]
LD307  R  5050LED  [5050LED]
LD308  G  5050LED  [5050LED]
LD309  B  5050LED  [5050LED]
LD310  A  5050LED  [5050LED]
LD311  C  5050LED  [5050LED]
LD312  L  5050LED  [5050LED]
LD313  R  5050LED  [5050LED]
LD314  G  5050LED  [5050LED]
LD315  B  5050LED  [5050LED]
LD316  A  5050LED  [5050LED]
LD317  C  5050LED  [5050LED]
LD318  L  5050LED  [5050LED]
LD319  R  5050LED  [5050LED]
LD320  G  5050LED  [5050LED]
LD321  B  5050LED  [5050LED]
LD322  A  5050LED  [5050LED]
LD323  C  5050LED  [5050LED]
LD324  L  5050LED  [5050LED]
LD325  R  5050LED  [5050LED]
LD326  G  5050LED  [5050LED]
LD327  B  5050LED  [5050LED]
LD328  A  5050LED  [5050LED]
LD329  C  5050LED  [5050LED]
LD330  L  5050LED  [5050LED]
LD331  R  5050LED  [5050LED]
LD332  G  5050LED  [5050LED]
LD333  B  5050LED  [5050LED]
LD334  A  5050LED  [5050LED]
LD335  C  5050LED  [5050LED]
LD336  L  5050LED  [5050LED]
LD337  R  5050LED  [5050LED]
LD338  G  5050LED  [5050LED]
LD339  B  5050LED  [5050LED]
LD340  A  5050LED  [5050LED]
LD341  C  5050LED  [5050LED]
LD342  L  5050LED  [5050LED]
LD343  R  5050LED  [5050LED]
LD344  G  5050LED  [5050LED]
LD345  B  5050LED  [5050LED]
LD346  A  5050LED  [5050LED]
LD347  C  5050LED  [5050LED]
LD348  L  5050LED  [5050LED]
LD349  R  5050LED  [5050LED]
LD350  G  5050LED  [5050LED]
LD351  B  5050LED  [5050LED]
LD352  A  5050LED  [5050LED]
LD353  C  5050LED  [5050LED]
LD354  L  5050LED  [5050LED]
LD355  R  5050LED  [5050LED]
LD356  G  5050LED  [5050LED]
LD357  B  5050LED  [5050LED]
LD358  A  5050LED  [5050LED]
LD359  C  5050LED  [5050LED]
LD360  L  5050LED  [5050LED]
LD361  R  5050LED  [5050LED]
LD362  G  5050LED  [5050LED]
LD363  B  5050LED  [5050LED]
LD364  A  5050LED  [5050LED]
LD365  C  5050LED  [5050LED]
LD366  L  5050LED  [5050LED]
R491  2k  R-US_R1206  [R1206]
R492  500  R-US_R0805  [R0805]
R493  500  R-US_R0805  [R0805]
R494  120  R-US_R0805  [R0805]
R495  4.3K  R-US_R0805  [R0805]
R496  2k  R-US_R1206  [R1206]
R497  500  R-US_R0805  [R0805]
R498  500  R-US_R0805  [R0805]
R499  120  R-US_R0805  [R0805]
R500  4.3K  R-US_R0805  [R0805]
R501  2k  R-US_R1206  [R1206]
R502  500  R-US_R0805  [R0805]
R503  500  R-US_R0805  [R0805]
R504  120  R-US_R0805  [R0805]
R505  4.3K  R-US_R0805  [R0805]
R506  2k  R-US_R1206  [R1206]
R507  500  R-US_R0805  [R0805]
R508  500  R-US_R0805  [R0805]
R509  120  R-US_R0805  [R0805]
R510  4.3K  R-US_R0805  [R0805]
R511  2k  R-US_R1206  [R1206]
R512  500  R-US_R0805  [R0805]
R513  500  R-US_R0805  [R0805]
R514  120  R-US_R0805  [R0805]
R515  4.3K  R-US_R0805  [R0805]
R516  2k  R-US_R1206  [R1206]
R517  500  R-US_R0805  [R0805]
R518  500  R-US_R0805  [R0805]
R519  120  R-US_R0805  [R0805]
R520  4.3K  R-US_R0805  [R0805]
R521  2k  R-US_R1206  [R1206]
R522  500  R-US_R0805  [R0805]
R523  500  R-US_R0805  [R0805]
R524  120  R-US_R0805  [R0805]
R525  4.3K  R-US_R0805  [R0805]
R526  2k  R-US_R1206  [R1206]
R527  500  R-US_R0805  [R0805]
R528  500  R-US_R0805  [R0805]
R529  120  R-US_R0805  [R0805]
R530  4.3K  R-US_R0805  [R0805]
R531  2k  R-US_R1206  [R1206]
R532  500  R-US_R0805  [R0805]
R533  500  R-US_R0805  [R0805]
R534  120  R-US_R0805  [R0805]
R535  4.3K  R-US_R0805  [R0805]
R536  2k  R-US_R1206  [R1206]
R537  500  R-US_R0805  [R0805]
R538  500  R-US_R0805  [R0805]
R539  120  R-US_R0805  [R0805]
R540  4.3K  R-US_R0805  [R0805]
R541  2k  R-US_R1206  [R1206]
R542  500  R-US_R0805  [R0805]
R543  500  R-US_R0805  [R0805]
R544  120  R-US_R0805  [R0805]
R545  4.3K  R-US_R0805  [R0805]
R546  2k  R-US_R1206  [R1206]
R547  500  R-US_R0805  [R0805]
R548  500  R-US_R0805  [R0805]
R549  120  R-US_R0805  [R0805]
R550  4.3K  R-US_R0805  [R0805]
R551  2k  R-US_R1206  [R1206]
R552  500  R-US_R0805  [R0805]
R553  500  R-US_R0805  [R0805]
R554  120  R-US_R0805  [R0805]
R555  4.3K  R-US_R0805  [R0805]
R556  2k  R-US_R1206  [R1206]
R557  500  R-US_R0805  [R0805]
R558  500  R-US_R0805  [R0805]
R559  120  R-US_R0805  [R0805]
R560  4.3K  R-US_R0805  [R0805]
R561  2k  R-US_R1206  [R1206]
R562  500  R-US_R0805  [R0805]
R563  500  R-US_R0805  [R0805]
R564  120  R-US_R0805  [R0805]
R565  4.3K  R-US_R0805  [R0805]
R566  2k  R-US_R1206  [R1206]
R567  500  R-US_R0805  [R0805]
R568  500  R-US_R0805  [R0805]
R569  120  R-US_R0805  [R0805]
R570  4.3K  R-US_R0805  [R0805]
R571  2k  R-US_R1206  [R1206]
R572  500  R-US_R0805  [R0805]
R573  500  R-US_R0805  [R0805]
R574  120  R-US_R0805  [R0805]
R575  4.3K  R-US_R0805  [R0805]
R576  2k  R-US_R1206  [R1206]
R577  500  R-US_R0805  [R0805]
R578  500  R-US_R0805  [R0805]
R579  120  R-US_R0805  [R0805]
R580  4.3K  R-US_R0805  [R0805]
R581  2k  R-US_R1206  [R1206]
R582  500  R-US_R0805  [R0805]
R583  500  R-US_R0805  [R0805]
R584  120  R-US_R0805  [R0805]
R585  4.3K  R-US_R0805  [R0805]
R586  2k  R-US_R1206  [R1206]
R587  500  R-US_R0805  [R0805]
R588  500  R-US_R0805  [R0805]
R589  120  R-US_R0805  [R0805]
R590  4.3K  R-US_R0805  [R0805]
R591  2k  R-US_R1206  [R1206]
R592  500  R-US_R0805  [R0805]
R593  500  R-US_R0805  [R0805]
R594  120  R-US_R0805  [R0805]
R595  4.3K  R-US_R0805  [R0805]
R596  2k  R-US_R1206  [R1206]
R597  500  R-US_R0805  [R0805]
R598  500  R-US_R0805  [R0805]
R599  120  R-US_R0805  [R0805]
R600  4.3K  R-US_R0805  [R0805]
R601  2k  R-US_R1206  [R1206]
R602  500  R-US_R0805  [R0805]
R603  500  R-US_R0805  [R0805]
R604  120  R-US_R0805  [R0805]
R605  4.3K  R-US_R0805  [R0805]
R606  2k  R-US_R1206  [R1206]
R607  500  R-US_R0805  [R0805]
R608  500  R-US_R0805  [R0805]
R609  120  R-US_R0805  [R0805]
R610  4.3K  R-US_R0805  [R0805]
U97  UCS7604  [SOP100P600X175-10N]
U98  UCS7604  [SOP100P600X175-10N]
U99  UCS7604  [SOP100P600X175-10N]
U100  UCS7604  [SOP100P600X175-10N]
U101  UCS7604  [SOP100P600X175-10N]
U102  UCS7604  [SOP100P600X175-10N]
U103  UCS7604  [SOP100P600X175-10N]
U104  UCS7604  [SOP100P600X175-10N]
U105  UCS7604  [SOP100P600X175-10N]
U106  UCS7604  [SOP100P600X175-10N]
U107  UCS7604  [SOP100P600X175-10N]
U108  UCS7604  [SOP100P600X175-10N]
U109  UCS7604  [SOP100P600X175-10N]
U110  UCS7604  [SOP100P600X175-10N]
U111  UCS7604  [SOP100P600X175-10N]
U112  UCS7604  [SOP100P600X175-10N]
U113  UCS7604  [SOP100P600X175-10N]
U114  UCS7604  [SOP100P600X175-10N]
U115  UCS7604  [SOP100P600X175-10N]
U116  UCS7604  [SOP100P600X175-10N]
U117  UCS7604  [SOP100P600X175-10N]
U118  UCS7604  [SOP100P600X175-10N]
U119  UCS7604  [SOP100P600X175-10N]
U120  UCS7604  [SOP100P600X175-10N]

### Nets
+24V: LD295.A LD296.A LD297.A LD298.A LD299.A LD300.A LD301.A LD302.A LD303.A LD304.A LD305.A LD306.A LD307.A LD308.A LD309.A LD310.A LD311.A LD312.A LD313.A LD314.A LD315.A LD316.A LD317.A LD318.A LD319.A LD320.A LD321.A LD322.A LD323.A LD324.A LD325.A LD326.A LD327.A LD328.A LD329.A LD330.A LD331.A LD332.A LD333.A LD334.A LD335.A LD336.A LD337.A LD338.A LD339.A LD340.A LD341.A LD342.A LD343.A LD344.A LD345.A LD346.A LD347.A LD348.A LD349.A LD350.A LD351.A LD352.A LD353.A LD354.A LD355.A LD356.A LD357.A LD358.A LD359.A LD360.A LD361.A LD362.A LD363.A LD364.A LD365.A LD366.A R491.2 R496.2 R501.2 R506.2 R511.2 R516.2 R521.2 R526.2 R531.2 R536.2 R541.2 R546.2 R551.2 R556.2 R561.2 R566.2 R571.2 R576.2 R581.2 R586.2 R591.2 R596.2 R601.2 R606.2 ; also sheet 1,2,3,4,6,7,8,9,10,11,12,13,14
DOUT_U95: R493.2 ; also sheet 4
DOUT_U96: R492.2 R498.2 ; also sheet 4
DOUT_U101: R524.1 R527.2 R543.2
DOUT_U102: R529.1 R542.2 R548.2
DOUT_U107: R514.1 R517.2 R533.2
DOUT_U108: R519.1 R532.2 R538.2
DOUT_U113: R554.1 R557.2 R583.2
DOUT_U114: R559.1 R582.2 R588.2
DOUT_U119: R604.1 R607.2 ; also sheet 6
DOUT_U120: R609.1 ; also sheet 6
GND: C99.2 C100.2 C101.2 C102.2 C103.2 C104.2 C105.2 C106.2 C107.2 C108.2 C109.2 C110.2 C111.2 C112.2 C113.2 C114.2 C115.2 C116.2 C117.2 C118.2 C119.2 C120.2 C121.2 C122.2 R495.1 R500.1 R505.1 R510.1 R515.1 R520.1 R525.1 R530.1 R535.1 R540.1 R545.1 R550.1 R555.1 R560.1 R565.1 R570.1 R575.1 R580.1 R585.1 R590.1 R595.1 R600.1 R605.1 R610.1 U97.5(GND) U98.5(GND) U99.5(GND) U100.5(GND) U101.5(GND) U102.5(GND) U103.5(GND) U104.5(GND) U105.5(GND) U106.5(GND) U107.5(GND) U108.5(GND) U109.5(GND) U110.5(GND) U111.5(GND) U112.5(GND) U113.5(GND) U114.5(GND) U115.5(GND) U116.5(GND) U117.5(GND) U118.5(GND) U119.5(GND) U120.5(GND) ; also sheet 1,2,3,4,6,7,8,9,10,11,12,13,14
N$36: C99.1 R491.1 U97.9(VDD)
N$59: LD295.K(C) U97.1(R)
N$60: LD296.K(C) U97.2(G)
N$80: LD297.K(C) U97.3(B)
N$1017: R492.1 U97.8(DIN)
N$1018: R493.1 U97.6(FDIN)
N$1019: R494.2 U97.10(DOUT)
N$1020: R495.2 U97.7(REXT)
N$1021: LD298.K(C) U98.1(R)
N$1022: LD299.K(C) U98.2(G)
N$1023: LD300.K(C) U98.3(B)
N$1024: C100.1 R496.1 U98.9(VDD)
N$1025: R497.1 U98.8(DIN)
N$1027: R498.1 U98.6(FDIN)
N$1030: R499.2 U98.10(DOUT)
N$1031: R500.2 U98.7(REXT)
N$1032: R499.1 R502.2 R508.2
N$1033: C101.1 R501.1 U99.9(VDD)
N$1034: LD301.K(C) U99.1(R)
N$1035: LD302.K(C) U99.2(G)
N$1036: LD303.K(C) U99.3(B)
N$1037: R502.1 U99.8(DIN)
N$1038: R503.1 U99.6(FDIN)
N$1039: R504.2 U99.10(DOUT)
N$1040: R505.2 U99.7(REXT)
N$1041: LD304.K(C) U100.1(R)
N$1042: LD305.K(C) U100.2(G)
N$1043: LD306.K(C) U100.3(B)
N$1044: C102.1 R506.1 U100.9(VDD)
N$1045: R507.1 U100.8(DIN)
N$1047: R508.1 U100.6(FDIN)
N$1049: R494.1 R497.2 R503.2
N$1050: R509.2 U100.10(DOUT)
N$1051: R510.2 U100.7(REXT)
N$1052: R509.1 R522.2 R528.2
N$1053: C103.1 R511.1 U107.9(VDD)
N$1054: LD307.K(C) U107.1(R)
N$1055: LD308.K(C) U107.2(G)
N$1056: LD309.K(C) U107.3(B)
N$1057: R512.1 U107.8(DIN)
N$1058: R513.1 U107.6(FDIN)
N$1059: R514.2 U107.10(DOUT)
N$1060: R515.2 U107.7(REXT)
N$1061: LD310.K(C) U108.1(R)
N$1062: LD311.K(C) U108.2(G)
N$1063: LD312.K(C) U108.3(B)
N$1064: C104.1 R516.1 U108.9(VDD)
N$1065: R517.1 U108.8(DIN)
N$1067: R518.1 U108.6(FDIN)
N$1070: R519.2 U108.10(DOUT)
N$1071: R520.2 U108.7(REXT)
N$1073: C105.1 R521.1 U101.9(VDD)
N$1074: LD313.K(C) U101.1(R)
N$1075: LD314.K(C) U101.2(G)
N$1076: LD315.K(C) U101.3(B)
N$1077: R522.1 U101.8(DIN)
N$1078: R523.1 U101.6(FDIN)
N$1079: R524.2 U101.10(DOUT)
N$1080: R525.2 U101.7(REXT)
N$1081: LD316.K(C) U102.1(R)
N$1082: LD317.K(C) U102.2(G)
N$1083: LD318.K(C) U102.3(B)
N$1084: C106.1 R526.1 U102.9(VDD)
N$1085: R527.1 U102.8(DIN)
N$1087: R528.1 U102.6(FDIN)
N$1089: R504.1 R507.2 R523.2
N$1090: R529.2 U102.10(DOUT)
N$1091: R530.2 U102.7(REXT)
N$1093: C107.1 R531.1 U109.9(VDD)
N$1094: LD319.K(C) U109.1(R)
N$1095: LD320.K(C) U109.2(G)
N$1096: LD321.K(C) U109.3(B)
N$1097: R532.1 U109.8(DIN)
N$1098: R533.1 U109.6(FDIN)
N$1099: R534.2 U109.10(DOUT)
N$1100: R535.2 U109.7(REXT)
N$1101: LD322.K(C) U110.1(R)
N$1102: LD323.K(C) U110.2(G)
N$1103: LD324.K(C) U110.3(B)
N$1104: C108.1 R536.1 U110.9(VDD)
N$1105: R537.1 U110.8(DIN)
N$1107: R538.1 U110.6(FDIN)
N$1110: R539.2 U110.10(DOUT)
N$1111: R540.2 U110.7(REXT)
N$1112: R539.1 R572.2 R578.2
N$1113: C109.1 R541.1 U103.9(VDD)
N$1114: LD325.K(C) U103.1(R)
N$1115: LD326.K(C) U103.2(G)
N$1116: LD327.K(C) U103.3(B)
N$1117: R542.1 U103.8(DIN)
N$1118: R543.1 U103.6(FDIN)
N$1119: R544.2 U103.10(DOUT)
N$1120: R545.2 U103.7(REXT)
N$1121: LD328.K(C) U104.1(R)
N$1122: LD329.K(C) U104.2(G)
N$1123: LD330.K(C) U104.3(B)
N$1124: C110.1 R546.1 U104.9(VDD)
N$1125: R547.1 U104.8(DIN)
N$1126: R544.1 R547.2 R563.2
N$1127: R548.1 U104.6(FDIN)
N$1130: R549.2 U104.10(DOUT)
N$1131: R550.2 U104.7(REXT)
N$1132: R549.1 R562.2 R568.2
N$1133: C111.1 R551.1 U113.9(VDD)
N$1134: LD331.K(C) U113.1(R)
N$1135: LD332.K(C) U113.2(G)
N$1136: LD333.K(C) U113.3(B)
N$1137: R552.1 U113.8(DIN)
N$1138: R553.1 U113.6(FDIN)
N$1139: R554.2 U113.10(DOUT)
N$1140: R555.2 U113.7(REXT)
N$1141: LD334.K(C) U114.1(R)
N$1142: LD335.K(C) U114.2(G)
N$1143: LD336.K(C) U114.3(B)
N$1144: C112.1 R556.1 U114.9(VDD)
N$1145: R557.1 U114.8(DIN)
N$1147: R558.1 U114.6(FDIN)
N$1149: R553.2 R574.1 R577.2
N$1150: R559.2 U114.10(DOUT)
N$1151: R560.2 U114.7(REXT)
N$1153: C113.1 R561.1 U105.9(VDD)
N$1154: LD337.K(C) U105.1(R)
N$1155: LD338.K(C) U105.2(G)
N$1156: LD339.K(C) U105.3(B)
N$1157: R562.1 U105.8(DIN)
N$1158: R563.1 U105.6(FDIN)
N$1159: R564.2 U105.10(DOUT)
N$1160: R565.2 U105.7(REXT)
N$1161: LD340.K(C) U106.1(R)
N$1162: LD341.K(C) U106.2(G)
N$1163: LD342.K(C) U106.3(B)
N$1164: C114.1 R566.1 U106.9(VDD)
N$1165: R567.1 U106.8(DIN)
N$1166: R513.2 R564.1 R567.2
N$1167: R568.1 U106.6(FDIN)
N$1170: R569.2 U106.10(DOUT)
N$1171: R570.2 U106.7(REXT)
N$1172: R512.2 R518.2 R569.1
N$1173: C115.1 R571.1 U111.9(VDD)
N$1174: LD343.K(C) U111.1(R)
N$1175: LD344.K(C) U111.2(G)
N$1176: LD345.K(C) U111.3(B)
N$1177: R572.1 U111.8(DIN)
N$1178: R573.1 U111.6(FDIN)
N$1179: R574.2 U111.10(DOUT)
N$1180: R575.2 U111.7(REXT)
N$1181: LD346.K(C) U112.1(R)
N$1182: LD347.K(C) U112.2(G)
N$1183: LD348.K(C) U112.3(B)
N$1184: C116.1 R576.1 U112.9(VDD)
N$1185: R577.1 U112.8(DIN)
N$1187: R578.1 U112.6(FDIN)
N$1189: R534.1 R537.2 R573.2
N$1190: R579.2 U112.10(DOUT)
N$1191: R580.2 U112.7(REXT)
N$1192: R552.2 R558.2 R579.1
N$1193: C117.1 R581.1 U115.9(VDD)
N$1194: LD349.K(C) U115.1(R)
N$1195: LD350.K(C) U115.2(G)
N$1196: LD351.K(C) U115.3(B)
N$1197: R582.1 U115.8(DIN)
N$1198: R583.1 U115.6(FDIN)
N$1199: R584.2 U115.10(DOUT)
N$1200: R585.2 U115.7(REXT)
N$1201: LD352.K(C) U116.1(R)
N$1202: LD353.K(C) U116.2(G)
N$1203: LD354.K(C) U116.3(B)
N$1204: C118.1 R586.1 U116.9(VDD)
N$1205: R587.1 U116.8(DIN)
N$1206: R584.1 R587.2 R593.2
N$1207: R588.1 U116.6(FDIN)
N$1210: R589.2 U116.10(DOUT)
N$1211: R590.2 U116.7(REXT)
N$1212: R589.1 R592.2 R598.2
N$1213: C119.1 R591.1 U117.9(VDD)
N$1214: LD355.K(C) U117.1(R)
N$1215: LD356.K(C) U117.2(G)
N$1216: LD357.K(C) U117.3(B)
N$1217: R592.1 U117.8(DIN)
N$1218: R593.1 U117.6(FDIN)
N$1219: R594.2 U117.10(DOUT)
N$1220: R595.2 U117.7(REXT)
N$1221: LD358.K(C) U118.1(R)
N$1222: LD359.K(C) U118.2(G)
N$1223: LD360.K(C) U118.3(B)
N$1224: C120.1 R596.1 U118.9(VDD)
N$1225: R597.1 U118.8(DIN)
N$1227: R598.1 U118.6(FDIN)
N$1230: R599.2 U118.10(DOUT)
N$1231: R600.2 U118.7(REXT)
N$1232: R599.1 R602.2 R608.2
N$1233: C121.1 R601.1 U119.9(VDD)
N$1234: LD361.K(C) U119.1(R)
N$1235: LD362.K(C) U119.2(G)
N$1236: LD363.K(C) U119.3(B)
N$1237: R602.1 U119.8(DIN)
N$1238: R603.1 U119.6(FDIN)
N$1239: R604.2 U119.10(DOUT)
N$1240: R605.2 U119.7(REXT)
N$1241: LD364.K(C) U120.1(R)
N$1242: LD365.K(C) U120.2(G)
N$1243: LD366.K(C) U120.3(B)
N$1244: C122.1 R606.1 U120.9(VDD)
N$1245: R607.1 U120.8(DIN)
N$1247: R608.1 U120.6(FDIN)
N$1249: R594.1 R597.2 R603.2
N$1250: R609.2 U120.10(DOUT)
N$1251: R610.2 U120.7(REXT)
Unconnected: U97.4(W) U98.4(W) U99.4(W) U100.4(W) U101.4(W) U102.4(W) U103.4(W) U104.4(W) U105.4(W) U106.4(W) U107.4(W) U108.4(W) U109.4(W) U110.4(W) U111.4(W) U112.4(W) U113.4(W) U114.4(W) U115.4(W) U116.4(W) U117.4(W) U118.4(W) U119.4(W) U120.4(W)

## Sheet 6 of 17: Row 6
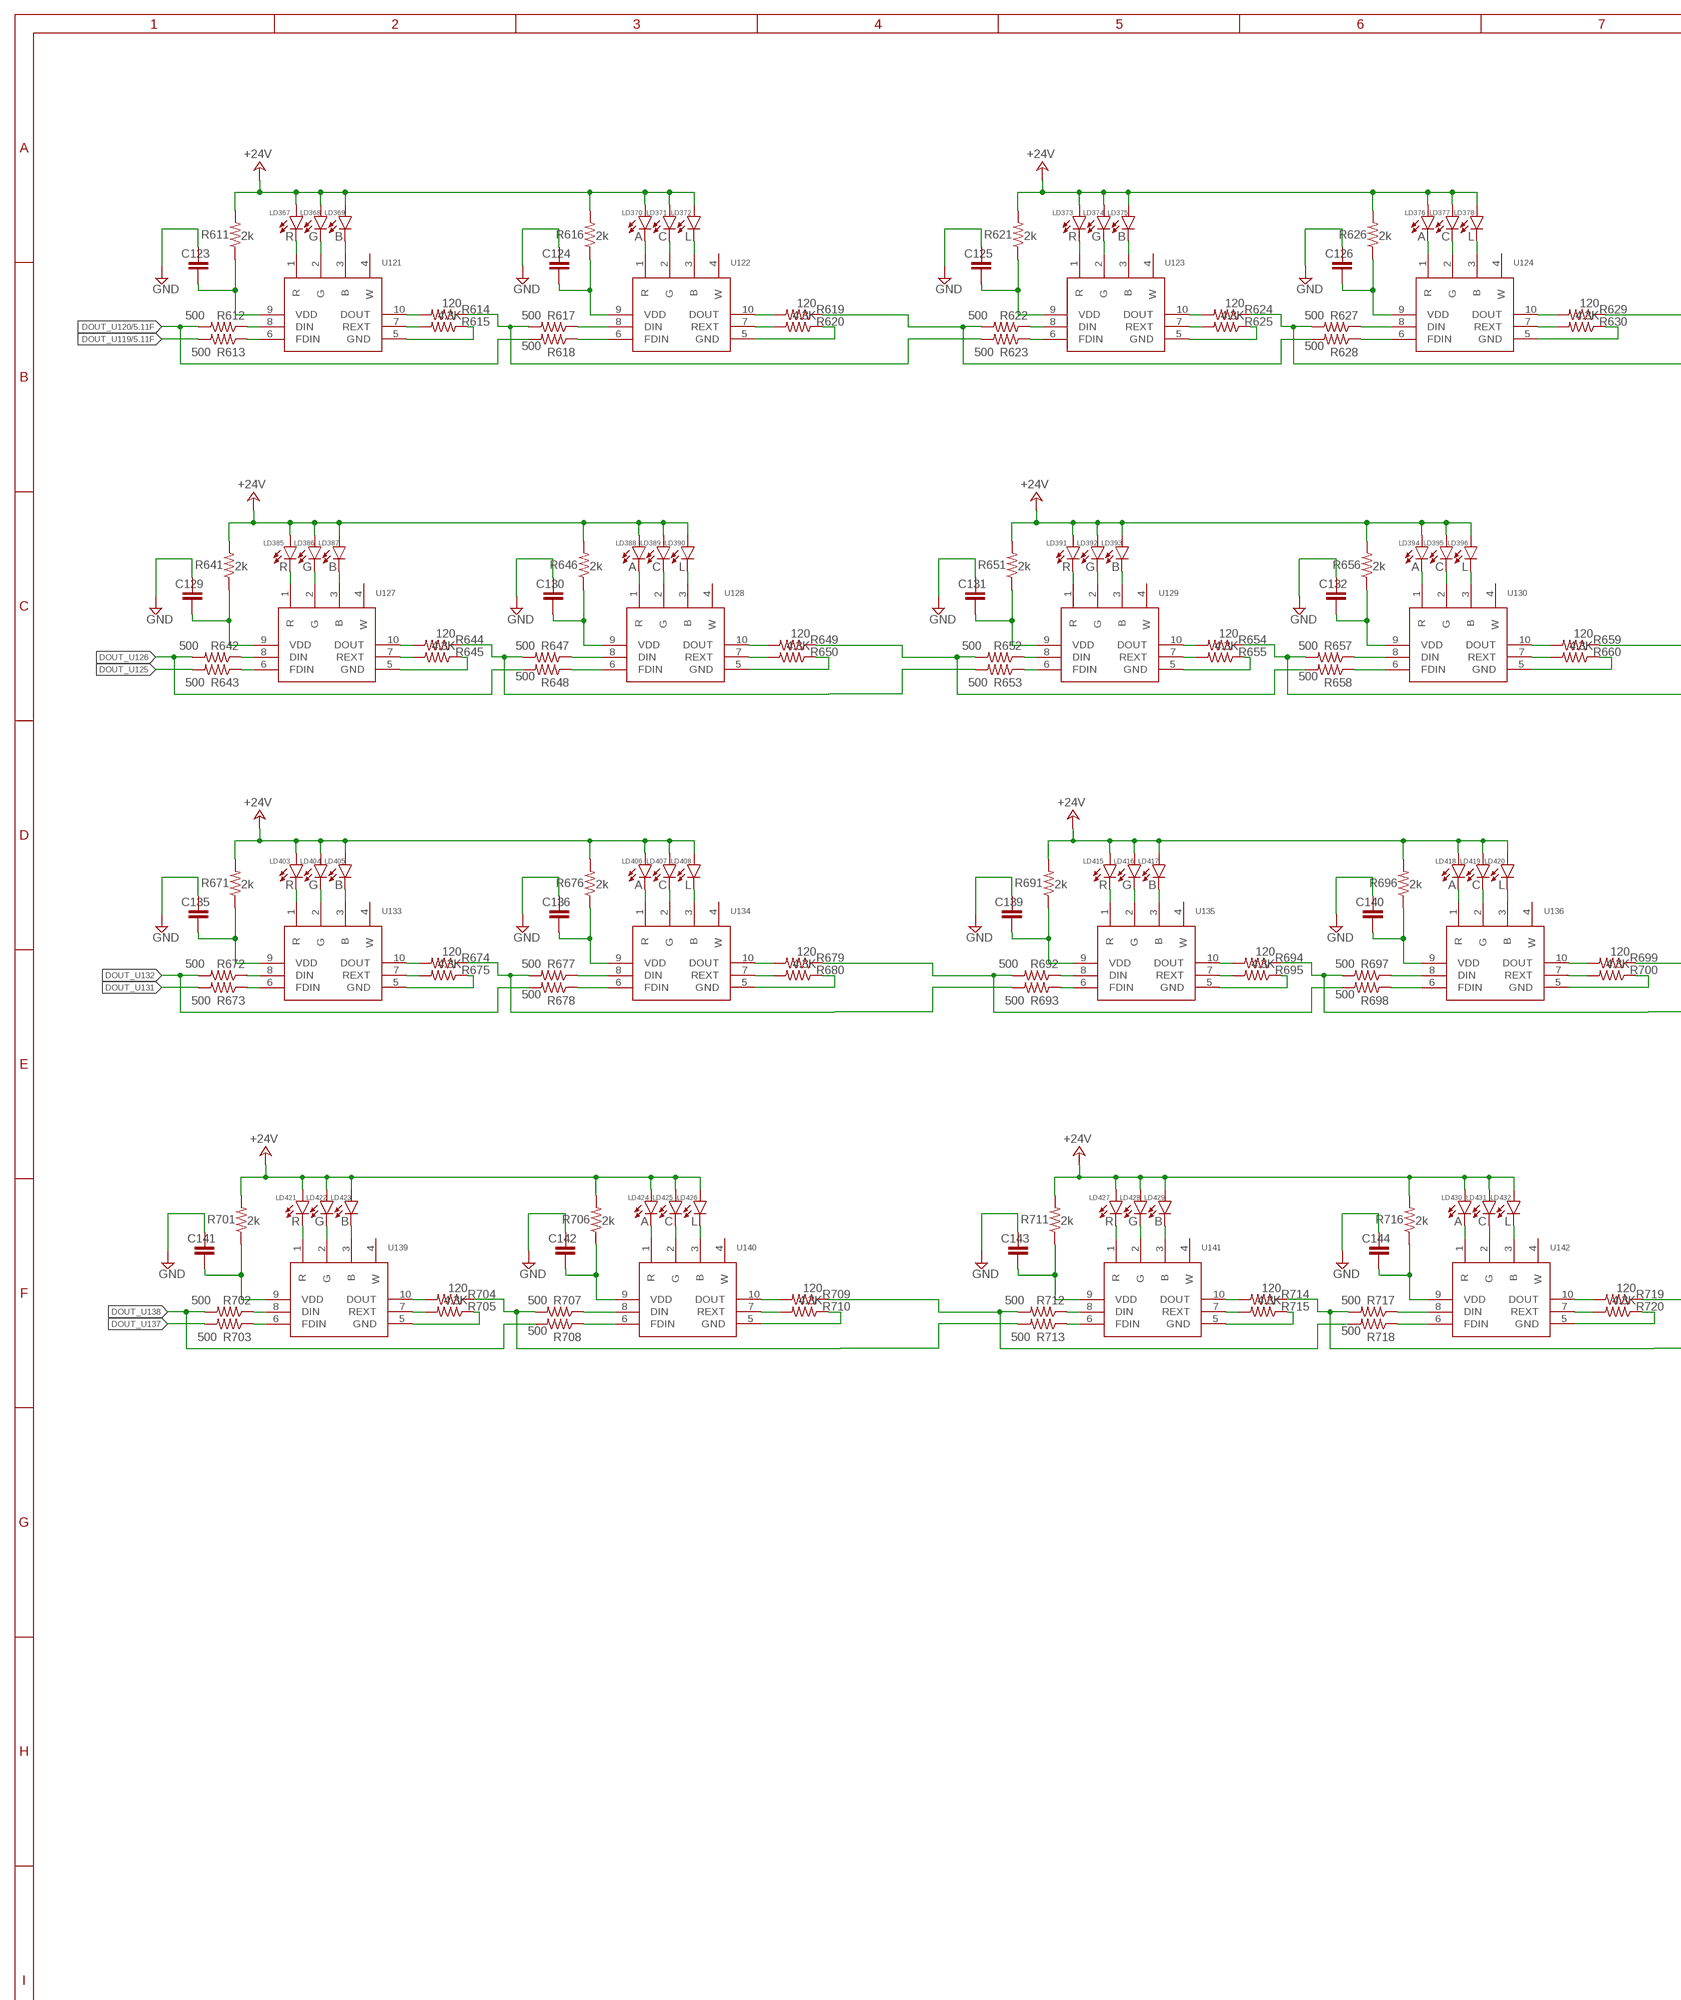
[diagram p10: schematic, sheet 6, part 1 of 2]
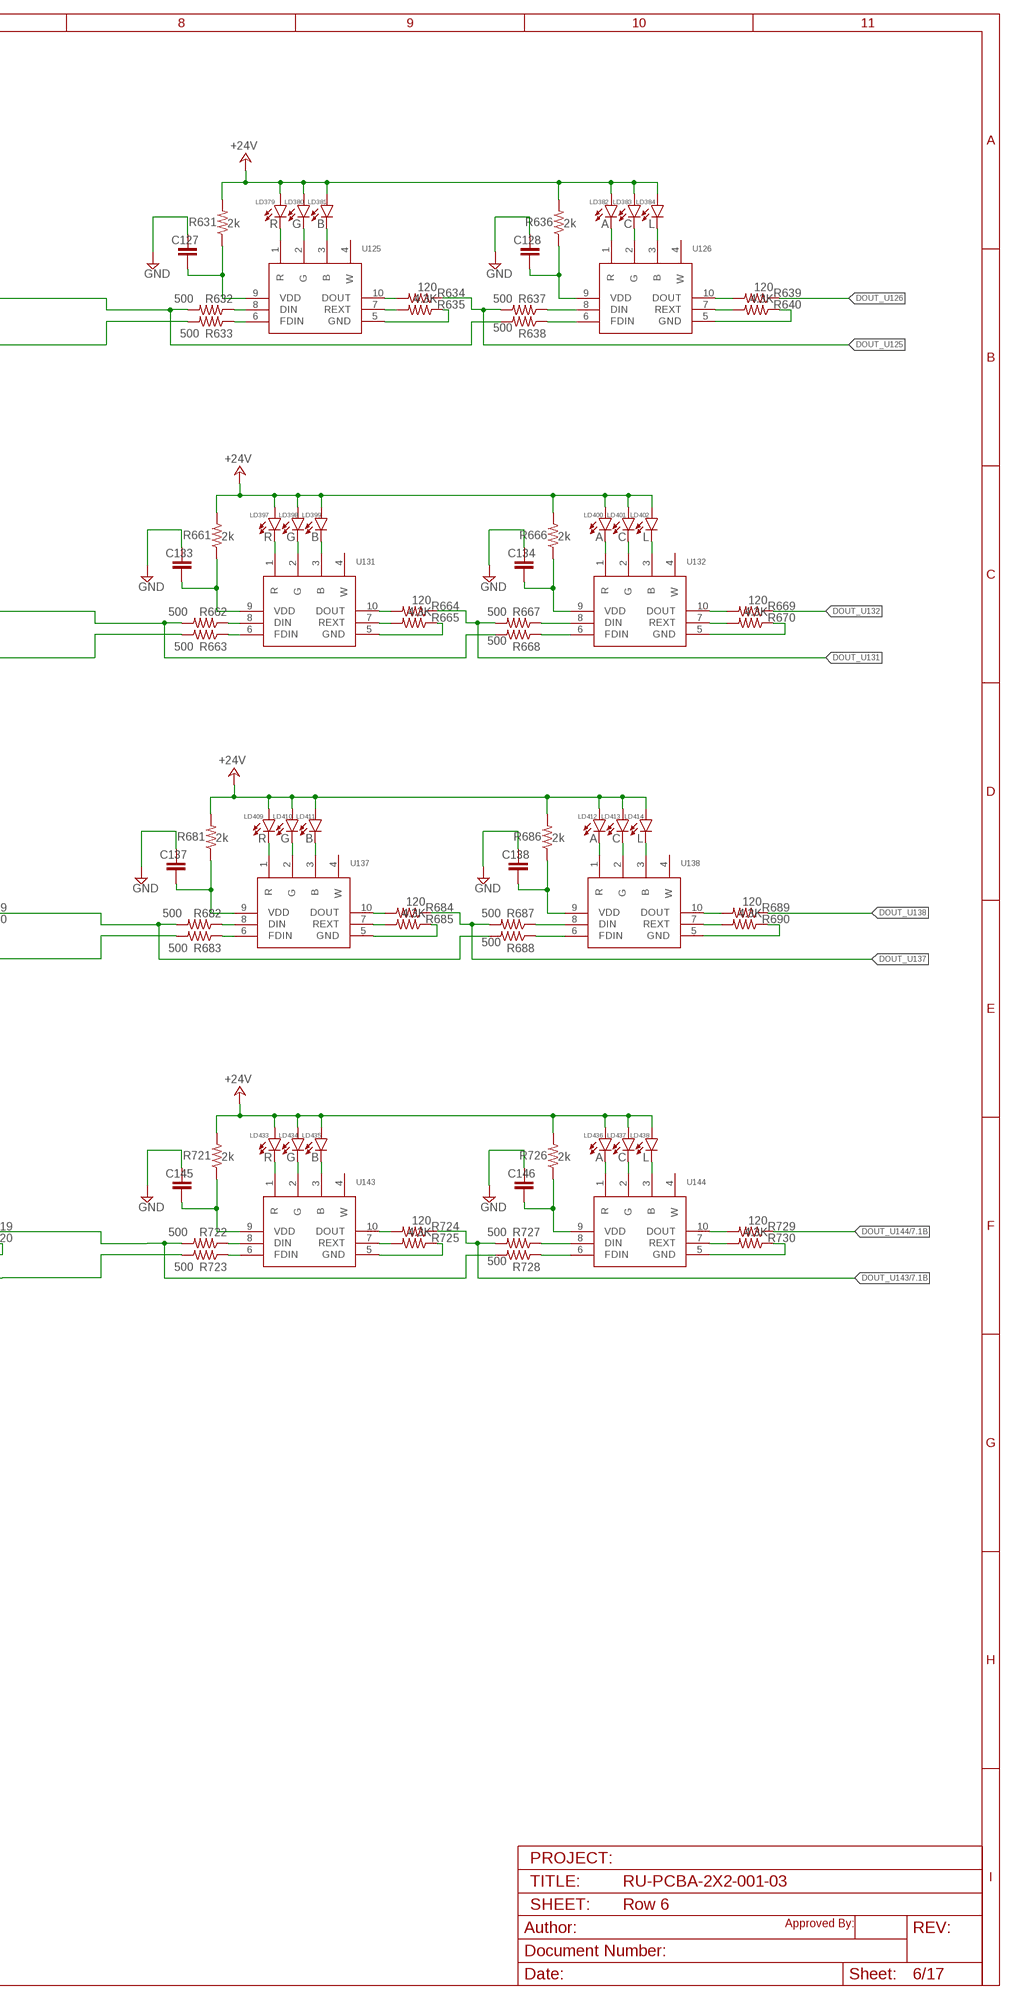
[diagram p11: schematic, sheet 6, part 2 of 2]

### Parts
C123  C-EUC1206  [C1206]
C124  C-EUC1206  [C1206]
C125  C-EUC1206  [C1206]
C126  C-EUC1206  [C1206]
C127  C-EUC1206  [C1206]
C128  C-EUC1206  [C1206]
C129  C-EUC1206  [C1206]
C130  C-EUC1206  [C1206]
C131  C-EUC1206  [C1206]
C132  C-EUC1206  [C1206]
C133  C-EUC1206  [C1206]
C134  C-EUC1206  [C1206]
C135  C-EUC1206  [C1206]
C136  C-EUC1206  [C1206]
C137  C-EUC1206  [C1206]
C138  C-EUC1206  [C1206]
C139  C-EUC1206  [C1206]
C140  C-EUC1206  [C1206]
C141  C-EUC1206  [C1206]
C142  C-EUC1206  [C1206]
C143  C-EUC1206  [C1206]
C144  C-EUC1206  [C1206]
C145  C-EUC1206  [C1206]
C146  C-EUC1206  [C1206]
LD367  R  5050LED  [5050LED]
LD368  G  5050LED  [5050LED]
LD369  B  5050LED  [5050LED]
LD370  A  5050LED  [5050LED]
LD371  C  5050LED  [5050LED]
LD372  L  5050LED  [5050LED]
LD373  R  5050LED  [5050LED]
LD374  G  5050LED  [5050LED]
LD375  B  5050LED  [5050LED]
LD376  A  5050LED  [5050LED]
LD377  C  5050LED  [5050LED]
LD378  L  5050LED  [5050LED]
LD379  R  5050LED  [5050LED]
LD380  G  5050LED  [5050LED]
LD381  B  5050LED  [5050LED]
LD382  A  5050LED  [5050LED]
LD383  C  5050LED  [5050LED]
LD384  L  5050LED  [5050LED]
LD385  R  5050LED  [5050LED]
LD386  G  5050LED  [5050LED]
LD387  B  5050LED  [5050LED]
LD388  A  5050LED  [5050LED]
LD389  C  5050LED  [5050LED]
LD390  L  5050LED  [5050LED]
LD391  R  5050LED  [5050LED]
LD392  G  5050LED  [5050LED]
LD393  B  5050LED  [5050LED]
LD394  A  5050LED  [5050LED]
LD395  C  5050LED  [5050LED]
LD396  L  5050LED  [5050LED]
LD397  R  5050LED  [5050LED]
LD398  G  5050LED  [5050LED]
LD399  B  5050LED  [5050LED]
LD400  A  5050LED  [5050LED]
LD401  C  5050LED  [5050LED]
LD402  L  5050LED  [5050LED]
LD403  R  5050LED  [5050LED]
LD404  G  5050LED  [5050LED]
LD405  B  5050LED  [5050LED]
LD406  A  5050LED  [5050LED]
LD407  C  5050LED  [5050LED]
LD408  L  5050LED  [5050LED]
LD409  R  5050LED  [5050LED]
LD410  G  5050LED  [5050LED]
LD411  B  5050LED  [5050LED]
LD412  A  5050LED  [5050LED]
LD413  C  5050LED  [5050LED]
LD414  L  5050LED  [5050LED]
LD415  R  5050LED  [5050LED]
LD416  G  5050LED  [5050LED]
LD417  B  5050LED  [5050LED]
LD418  A  5050LED  [5050LED]
LD419  C  5050LED  [5050LED]
LD420  L  5050LED  [5050LED]
LD421  R  5050LED  [5050LED]
LD422  G  5050LED  [5050LED]
LD423  B  5050LED  [5050LED]
LD424  A  5050LED  [5050LED]
LD425  C  5050LED  [5050LED]
LD426  L  5050LED  [5050LED]
LD427  R  5050LED  [5050LED]
LD428  G  5050LED  [5050LED]
LD429  B  5050LED  [5050LED]
LD430  A  5050LED  [5050LED]
LD431  C  5050LED  [5050LED]
LD432  L  5050LED  [5050LED]
LD433  R  5050LED  [5050LED]
LD434  G  5050LED  [5050LED]
LD435  B  5050LED  [5050LED]
LD436  A  5050LED  [5050LED]
LD437  C  5050LED  [5050LED]
LD438  L  5050LED  [5050LED]
R611  2k  R-US_R1206  [R1206]
R612  500  R-US_R0805  [R0805]
R613  500  R-US_R0805  [R0805]
R614  120  R-US_R0805  [R0805]
R615  4.3K  R-US_R0805  [R0805]
R616  2k  R-US_R1206  [R1206]
R617  500  R-US_R0805  [R0805]
R618  500  R-US_R0805  [R0805]
R619  120  R-US_R0805  [R0805]
R620  4.3K  R-US_R0805  [R0805]
R621  2k  R-US_R1206  [R1206]
R622  500  R-US_R0805  [R0805]
R623  500  R-US_R0805  [R0805]
R624  120  R-US_R0805  [R0805]
R625  4.3K  R-US_R0805  [R0805]
R626  2k  R-US_R1206  [R1206]
R627  500  R-US_R0805  [R0805]
R628  500  R-US_R0805  [R0805]
R629  120  R-US_R0805  [R0805]
R630  4.3K  R-US_R0805  [R0805]
R631  2k  R-US_R1206  [R1206]
R632  500  R-US_R0805  [R0805]
R633  500  R-US_R0805  [R0805]
R634  120  R-US_R0805  [R0805]
R635  4.3K  R-US_R0805  [R0805]
R636  2k  R-US_R1206  [R1206]
R637  500  R-US_R0805  [R0805]
R638  500  R-US_R0805  [R0805]
R639  120  R-US_R0805  [R0805]
R640  4.3K  R-US_R0805  [R0805]
R641  2k  R-US_R1206  [R1206]
R642  500  R-US_R0805  [R0805]
R643  500  R-US_R0805  [R0805]
R644  120  R-US_R0805  [R0805]
R645  4.3K  R-US_R0805  [R0805]
R646  2k  R-US_R1206  [R1206]
R647  500  R-US_R0805  [R0805]
R648  500  R-US_R0805  [R0805]
R649  120  R-US_R0805  [R0805]
R650  4.3K  R-US_R0805  [R0805]
R651  2k  R-US_R1206  [R1206]
R652  500  R-US_R0805  [R0805]
R653  500  R-US_R0805  [R0805]
R654  120  R-US_R0805  [R0805]
R655  4.3K  R-US_R0805  [R0805]
R656  2k  R-US_R1206  [R1206]
R657  500  R-US_R0805  [R0805]
R658  500  R-US_R0805  [R0805]
R659  120  R-US_R0805  [R0805]
R660  4.3K  R-US_R0805  [R0805]
R661  2k  R-US_R1206  [R1206]
R662  500  R-US_R0805  [R0805]
R663  500  R-US_R0805  [R0805]
R664  120  R-US_R0805  [R0805]
R665  4.3K  R-US_R0805  [R0805]
R666  2k  R-US_R1206  [R1206]
R667  500  R-US_R0805  [R0805]
R668  500  R-US_R0805  [R0805]
R669  120  R-US_R0805  [R0805]
R670  4.3K  R-US_R0805  [R0805]
R671  2k  R-US_R1206  [R1206]
R672  500  R-US_R0805  [R0805]
R673  500  R-US_R0805  [R0805]
R674  120  R-US_R0805  [R0805]
R675  4.3K  R-US_R0805  [R0805]
R676  2k  R-US_R1206  [R1206]
R677  500  R-US_R0805  [R0805]
R678  500  R-US_R0805  [R0805]
R679  120  R-US_R0805  [R0805]
R680  4.3K  R-US_R0805  [R0805]
R681  2k  R-US_R1206  [R1206]
R682  500  R-US_R0805  [R0805]
R683  500  R-US_R0805  [R0805]
R684  120  R-US_R0805  [R0805]
R685  4.3K  R-US_R0805  [R0805]
R686  2k  R-US_R1206  [R1206]
R687  500  R-US_R0805  [R0805]
R688  500  R-US_R0805  [R0805]
R689  120  R-US_R0805  [R0805]
R690  4.3K  R-US_R0805  [R0805]
R691  2k  R-US_R1206  [R1206]
R692  500  R-US_R0805  [R0805]
R693  500  R-US_R0805  [R0805]
R694  120  R-US_R0805  [R0805]
R695  4.3K  R-US_R0805  [R0805]
R696  2k  R-US_R1206  [R1206]
R697  500  R-US_R0805  [R0805]
R698  500  R-US_R0805  [R0805]
R699  120  R-US_R0805  [R0805]
R700  4.3K  R-US_R0805  [R0805]
R701  2k  R-US_R1206  [R1206]
R702  500  R-US_R0805  [R0805]
R703  500  R-US_R0805  [R0805]
R704  120  R-US_R0805  [R0805]
R705  4.3K  R-US_R0805  [R0805]
R706  2k  R-US_R1206  [R1206]
R707  500  R-US_R0805  [R0805]
R708  500  R-US_R0805  [R0805]
R709  120  R-US_R0805  [R0805]
R710  4.3K  R-US_R0805  [R0805]
R711  2k  R-US_R1206  [R1206]
R712  500  R-US_R0805  [R0805]
R713  500  R-US_R0805  [R0805]
R714  120  R-US_R0805  [R0805]
R715  4.3K  R-US_R0805  [R0805]
R716  2k  R-US_R1206  [R1206]
R717  500  R-US_R0805  [R0805]
R718  500  R-US_R0805  [R0805]
R719  120  R-US_R0805  [R0805]
R720  4.3K  R-US_R0805  [R0805]
R721  2k  R-US_R1206  [R1206]
R722  500  R-US_R0805  [R0805]
R723  500  R-US_R0805  [R0805]
R724  120  R-US_R0805  [R0805]
R725  4.3K  R-US_R0805  [R0805]
R726  2k  R-US_R1206  [R1206]
R727  500  R-US_R0805  [R0805]
R728  500  R-US_R0805  [R0805]
R729  120  R-US_R0805  [R0805]
R730  4.3K  R-US_R0805  [R0805]
U121  UCS7604  [SOP100P600X175-10N]
U122  UCS7604  [SOP100P600X175-10N]
U123  UCS7604  [SOP100P600X175-10N]
U124  UCS7604  [SOP100P600X175-10N]
U125  UCS7604  [SOP100P600X175-10N]
U126  UCS7604  [SOP100P600X175-10N]
U127  UCS7604  [SOP100P600X175-10N]
U128  UCS7604  [SOP100P600X175-10N]
U129  UCS7604  [SOP100P600X175-10N]
U130  UCS7604  [SOP100P600X175-10N]
U131  UCS7604  [SOP100P600X175-10N]
U132  UCS7604  [SOP100P600X175-10N]
U133  UCS7604  [SOP100P600X175-10N]
U134  UCS7604  [SOP100P600X175-10N]
U135  UCS7604  [SOP100P600X175-10N]
U136  UCS7604  [SOP100P600X175-10N]
U137  UCS7604  [SOP100P600X175-10N]
U138  UCS7604  [SOP100P600X175-10N]
U139  UCS7604  [SOP100P600X175-10N]
U140  UCS7604  [SOP100P600X175-10N]
U141  UCS7604  [SOP100P600X175-10N]
U142  UCS7604  [SOP100P600X175-10N]
U143  UCS7604  [SOP100P600X175-10N]
U144  UCS7604  [SOP100P600X175-10N]

### Nets
+24V: LD367.A LD368.A LD369.A LD370.A LD371.A LD372.A LD373.A LD374.A LD375.A LD376.A LD377.A LD378.A LD379.A LD380.A LD381.A LD382.A LD383.A LD384.A LD385.A LD386.A LD387.A LD388.A LD389.A LD390.A LD391.A LD392.A LD393.A LD394.A LD395.A LD396.A LD397.A LD398.A LD399.A LD400.A LD401.A LD402.A LD403.A LD404.A LD405.A LD406.A LD407.A LD408.A LD409.A LD410.A LD411.A LD412.A LD413.A LD414.A LD415.A LD416.A LD417.A LD418.A LD419.A LD420.A LD421.A LD422.A LD423.A LD424.A LD425.A LD426.A LD427.A LD428.A LD429.A LD430.A LD431.A LD432.A LD433.A LD434.A LD435.A LD436.A LD437.A LD438.A R611.2 R616.2 R621.2 R626.2 R631.2 R636.2 R641.2 R646.2 R651.2 R656.2 R661.2 R666.2 R671.2 R676.2 R681.2 R686.2 R691.2 R696.2 R701.2 R706.2 R711.2 R716.2 R721.2 R726.2 ; also sheet 1,2,3,4,5,7,8,9,10,11,12,13,14
DOUT_U119: R613.2 ; also sheet 5
DOUT_U120: R612.2 R618.2 ; also sheet 5
DOUT_U125: R634.1 R637.2 R643.2
DOUT_U126: R639.1 R642.2 R648.2
DOUT_U131: R664.1 R667.2 R673.2
DOUT_U132: R669.1 R672.2 R678.2
DOUT_U137: R684.1 R687.2 R703.2
DOUT_U138: R689.1 R702.2 R708.2
DOUT_U143: R724.1 R727.2 ; also sheet 7
DOUT_U144: R729.1 ; also sheet 7
GND: C123.2 C124.2 C125.2 C126.2 C127.2 C128.2 C129.2 C130.2 C131.2 C132.2 C133.2 C134.2 C135.2 C136.2 C137.2 C138.2 C139.2 C140.2 C141.2 C142.2 C143.2 C144.2 C145.2 C146.2 R615.1 R620.1 R625.1 R630.1 R635.1 R640.1 R645.1 R650.1 R655.1 R660.1 R665.1 R670.1 R675.1 R680.1 R685.1 R690.1 R695.1 R700.1 R705.1 R710.1 R715.1 R720.1 R725.1 R730.1 U121.5(GND) U122.5(GND) U123.5(GND) U124.5(GND) U125.5(GND) U126.5(GND) U127.5(GND) U128.5(GND) U129.5(GND) U130.5(GND) U131.5(GND) U132.5(GND) U133.5(GND) U134.5(GND) U135.5(GND) U136.5(GND) U137.5(GND) U138.5(GND) U139.5(GND) U140.5(GND) U141.5(GND) U142.5(GND) U143.5(GND) U144.5(GND) ; also sheet 1,2,3,4,5,7,8,9,10,11,12,13,14
N$1253: C123.1 R611.1 U121.9(VDD)
N$1254: LD367.K(C) U121.1(R)
N$1255: LD368.K(C) U121.2(G)
N$1256: LD369.K(C) U121.3(B)
N$1257: R612.1 U121.8(DIN)
N$1258: R613.1 U121.6(FDIN)
N$1259: R614.2 U121.10(DOUT)
N$1260: R615.2 U121.7(REXT)
N$1261: LD370.K(C) U122.1(R)
N$1262: LD371.K(C) U122.2(G)
N$1263: LD372.K(C) U122.3(B)
N$1264: C124.1 R616.1 U122.9(VDD)
N$1265: R617.1 U122.8(DIN)
N$1267: R618.1 U122.6(FDIN)
N$1270: R619.2 U122.10(DOUT)
N$1271: R620.2 U122.7(REXT)
N$1272: R619.1 R622.2 R628.2
N$1273: C125.1 R621.1 U123.9(VDD)
N$1274: LD373.K(C) U123.1(R)
N$1275: LD374.K(C) U123.2(G)
N$1276: LD375.K(C) U123.3(B)
N$1277: R622.1 U123.8(DIN)
N$1278: R623.1 U123.6(FDIN)
N$1279: R624.2 U123.10(DOUT)
N$1280: R625.2 U123.7(REXT)
N$1281: LD376.K(C) U124.1(R)
N$1282: LD377.K(C) U124.2(G)
N$1283: LD378.K(C) U124.3(B)
N$1284: C126.1 R626.1 U124.9(VDD)
N$1285: R627.1 U124.8(DIN)
N$1287: R628.1 U124.6(FDIN)
N$1289: R614.1 R617.2 R623.2
N$1290: R629.2 U124.10(DOUT)
N$1291: R630.2 U124.7(REXT)
N$1292: R629.1 R632.2 R638.2
N$1293: C127.1 R631.1 U125.9(VDD)
N$1294: LD379.K(C) U125.1(R)
N$1295: LD380.K(C) U125.2(G)
N$1296: LD381.K(C) U125.3(B)
N$1297: R632.1 U125.8(DIN)
N$1298: R633.1 U125.6(FDIN)
N$1299: R634.2 U125.10(DOUT)
N$1300: R635.2 U125.7(REXT)
N$1301: LD382.K(C) U126.1(R)
N$1302: LD383.K(C) U126.2(G)
N$1303: LD384.K(C) U126.3(B)
N$1304: C128.1 R636.1 U126.9(VDD)
N$1305: R637.1 U126.8(DIN)
N$1307: R638.1 U126.6(FDIN)
N$1309: R624.1 R627.2 R633.2
N$1310: R639.2 U126.10(DOUT)
N$1311: R640.2 U126.7(REXT)
N$1313: C129.1 R641.1 U127.9(VDD)
N$1314: LD385.K(C) U127.1(R)
N$1315: LD386.K(C) U127.2(G)
N$1316: LD387.K(C) U127.3(B)
N$1317: R642.1 U127.8(DIN)
N$1318: R643.1 U127.6(FDIN)
N$1319: R644.2 U127.10(DOUT)
N$1320: R645.2 U127.7(REXT)
N$1321: LD388.K(C) U128.1(R)
N$1322: LD389.K(C) U128.2(G)
N$1323: LD390.K(C) U128.3(B)
N$1324: C130.1 R646.1 U128.9(VDD)
N$1325: R647.1 U128.8(DIN)
N$1327: R648.1 U128.6(FDIN)
N$1330: R649.2 U128.10(DOUT)
N$1331: R650.2 U128.7(REXT)
N$1332: R649.1 R652.2 R658.2
N$1333: C131.1 R651.1 U129.9(VDD)
N$1334: LD391.K(C) U129.1(R)
N$1335: LD392.K(C) U129.2(G)
N$1336: LD393.K(C) U129.3(B)
N$1337: R652.1 U129.8(DIN)
N$1338: R653.1 U129.6(FDIN)
N$1339: R654.2 U129.10(DOUT)
N$1340: R655.2 U129.7(REXT)
N$1341: LD394.K(C) U130.1(R)
N$1342: LD395.K(C) U130.2(G)
N$1343: LD396.K(C) U130.3(B)
N$1344: C132.1 R656.1 U130.9(VDD)
N$1345: R657.1 U130.8(DIN)
N$1347: R658.1 U130.6(FDIN)
N$1349: R644.1 R647.2 R653.2
N$1350: R659.2 U130.10(DOUT)
N$1351: R660.2 U130.7(REXT)
N$1352: R659.1 R662.2 R668.2
N$1353: C133.1 R661.1 U131.9(VDD)
N$1354: LD397.K(C) U131.1(R)
N$1355: LD398.K(C) U131.2(G)
N$1356: LD399.K(C) U131.3(B)
N$1357: R662.1 U131.8(DIN)
N$1358: R663.1 U131.6(FDIN)
N$1359: R664.2 U131.10(DOUT)
N$1360: R665.2 U131.7(REXT)
N$1361: LD400.K(C) U132.1(R)
N$1362: LD401.K(C) U132.2(G)
N$1363: LD402.K(C) U132.3(B)
N$1364: C134.1 R666.1 U132.9(VDD)
N$1365: R667.1 U132.8(DIN)
N$1367: R668.1 U132.6(FDIN)
N$1369: R654.1 R657.2 R663.2
N$1370: R669.2 U132.10(DOUT)
N$1371: R670.2 U132.7(REXT)
N$1373: C135.1 R671.1 U133.9(VDD)
N$1374: LD403.K(C) U133.1(R)
N$1375: LD404.K(C) U133.2(G)
N$1376: LD405.K(C) U133.3(B)
N$1377: R672.1 U133.8(DIN)
N$1378: R673.1 U133.6(FDIN)
N$1379: R674.2 U133.10(DOUT)
N$1380: R675.2 U133.7(REXT)
N$1381: LD406.K(C) U134.1(R)
N$1382: LD407.K(C) U134.2(G)
N$1383: LD408.K(C) U134.3(B)
N$1384: C136.1 R676.1 U134.9(VDD)
N$1385: R677.1 U134.8(DIN)
N$1387: R678.1 U134.6(FDIN)
N$1390: R679.2 U134.10(DOUT)
N$1391: R680.2 U134.7(REXT)
N$1392: R679.1 R692.2 R698.2
N$1393: C137.1 R681.1 U137.9(VDD)
N$1394: LD409.K(C) U137.1(R)
N$1395: LD410.K(C) U137.2(G)
N$1396: LD411.K(C) U137.3(B)
N$1397: R682.1 U137.8(DIN)
N$1398: R683.1 U137.6(FDIN)
N$1399: R684.2 U137.10(DOUT)
N$1400: R685.2 U137.7(REXT)
N$1401: LD412.K(C) U138.1(R)
N$1402: LD413.K(C) U138.2(G)
N$1403: LD414.K(C) U138.3(B)
N$1404: C138.1 R686.1 U138.9(VDD)
N$1405: R687.1 U138.8(DIN)
N$1407: R688.1 U138.6(FDIN)
N$1409: R683.2 R694.1 R697.2
N$1410: R689.2 U138.10(DOUT)
N$1411: R690.2 U138.7(REXT)
N$1413: C139.1 R691.1 U135.9(VDD)
N$1414: LD415.K(C) U135.1(R)
N$1415: LD416.K(C) U135.2(G)
N$1416: LD417.K(C) U135.3(B)
N$1417: R692.1 U135.8(DIN)
N$1418: R693.1 U135.6(FDIN)
N$1419: R694.2 U135.10(DOUT)
N$1420: R695.2 U135.7(REXT)
N$1421: LD418.K(C) U136.1(R)
N$1422: LD419.K(C) U136.2(G)
N$1423: LD420.K(C) U136.3(B)
N$1424: C140.1 R696.1 U136.9(VDD)
N$1425: R697.1 U136.8(DIN)
N$1427: R698.1 U136.6(FDIN)
N$1429: R674.1 R677.2 R693.2
N$1430: R699.2 U136.10(DOUT)
N$1431: R700.2 U136.7(REXT)
N$1432: R682.2 R688.2 R699.1
N$1433: C141.1 R701.1 U139.9(VDD)
N$1434: LD421.K(C) U139.1(R)
N$1435: LD422.K(C) U139.2(G)
N$1436: LD423.K(C) U139.3(B)
N$1437: R702.1 U139.8(DIN)
N$1438: R703.1 U139.6(FDIN)
N$1439: R704.2 U139.10(DOUT)
N$1440: R705.2 U139.7(REXT)
N$1441: LD424.K(C) U140.1(R)
N$1442: LD425.K(C) U140.2(G)
N$1443: LD426.K(C) U140.3(B)
N$1444: C142.1 R706.1 U140.9(VDD)
N$1445: R707.1 U140.8(DIN)
N$1447: R708.1 U140.6(FDIN)
N$1450: R709.2 U140.10(DOUT)
N$1451: R710.2 U140.7(REXT)
N$1452: R709.1 R712.2 R718.2
N$1453: C143.1 R711.1 U141.9(VDD)
N$1454: LD427.K(C) U141.1(R)
N$1455: LD428.K(C) U141.2(G)
N$1456: LD429.K(C) U141.3(B)
N$1457: R712.1 U141.8(DIN)
N$1458: R713.1 U141.6(FDIN)
N$1459: R714.2 U141.10(DOUT)
N$1460: R715.2 U141.7(REXT)
N$1461: LD430.K(C) U142.1(R)
N$1462: LD431.K(C) U142.2(G)
N$1463: LD432.K(C) U142.3(B)
N$1464: C144.1 R716.1 U142.9(VDD)
N$1465: R717.1 U142.8(DIN)
N$1467: R718.1 U142.6(FDIN)
N$1469: R704.1 R707.2 R713.2
N$1470: R719.2 U142.10(DOUT)
N$1471: R720.2 U142.7(REXT)
N$1472: R719.1 R722.2 R728.2
N$1473: C145.1 R721.1 U143.9(VDD)
N$1474: LD433.K(C) U143.1(R)
N$1475: LD434.K(C) U143.2(G)
N$1476: LD435.K(C) U143.3(B)
N$1477: R722.1 U143.8(DIN)
N$1478: R723.1 U143.6(FDIN)
N$1479: R724.2 U143.10(DOUT)
N$1480: R725.2 U143.7(REXT)
N$1481: LD436.K(C) U144.1(R)
N$1482: LD437.K(C) U144.2(G)
N$1483: LD438.K(C) U144.3(B)
N$1484: C146.1 R726.1 U144.9(VDD)
N$1485: R727.1 U144.8(DIN)
N$1487: R728.1 U144.6(FDIN)
N$1489: R714.1 R717.2 R723.2
N$1490: R729.2 U144.10(DOUT)
N$1491: R730.2 U144.7(REXT)
Unconnected: U121.4(W) U122.4(W) U123.4(W) U124.4(W) U125.4(W) U126.4(W) U127.4(W) U128.4(W) U129.4(W) U130.4(W) U131.4(W) U132.4(W) U133.4(W) U134.4(W) U135.4(W) U136.4(W) U137.4(W) U138.4(W) U139.4(W) U140.4(W) U141.4(W) U142.4(W) U143.4(W) U144.4(W)